# Altium project SBC_Project.PrjPcb (part 3 of 3)

## Sheet 05_SoC_Interfaces.SchDoc
size A3; SheetNumber: 16; SheetTotal: 21
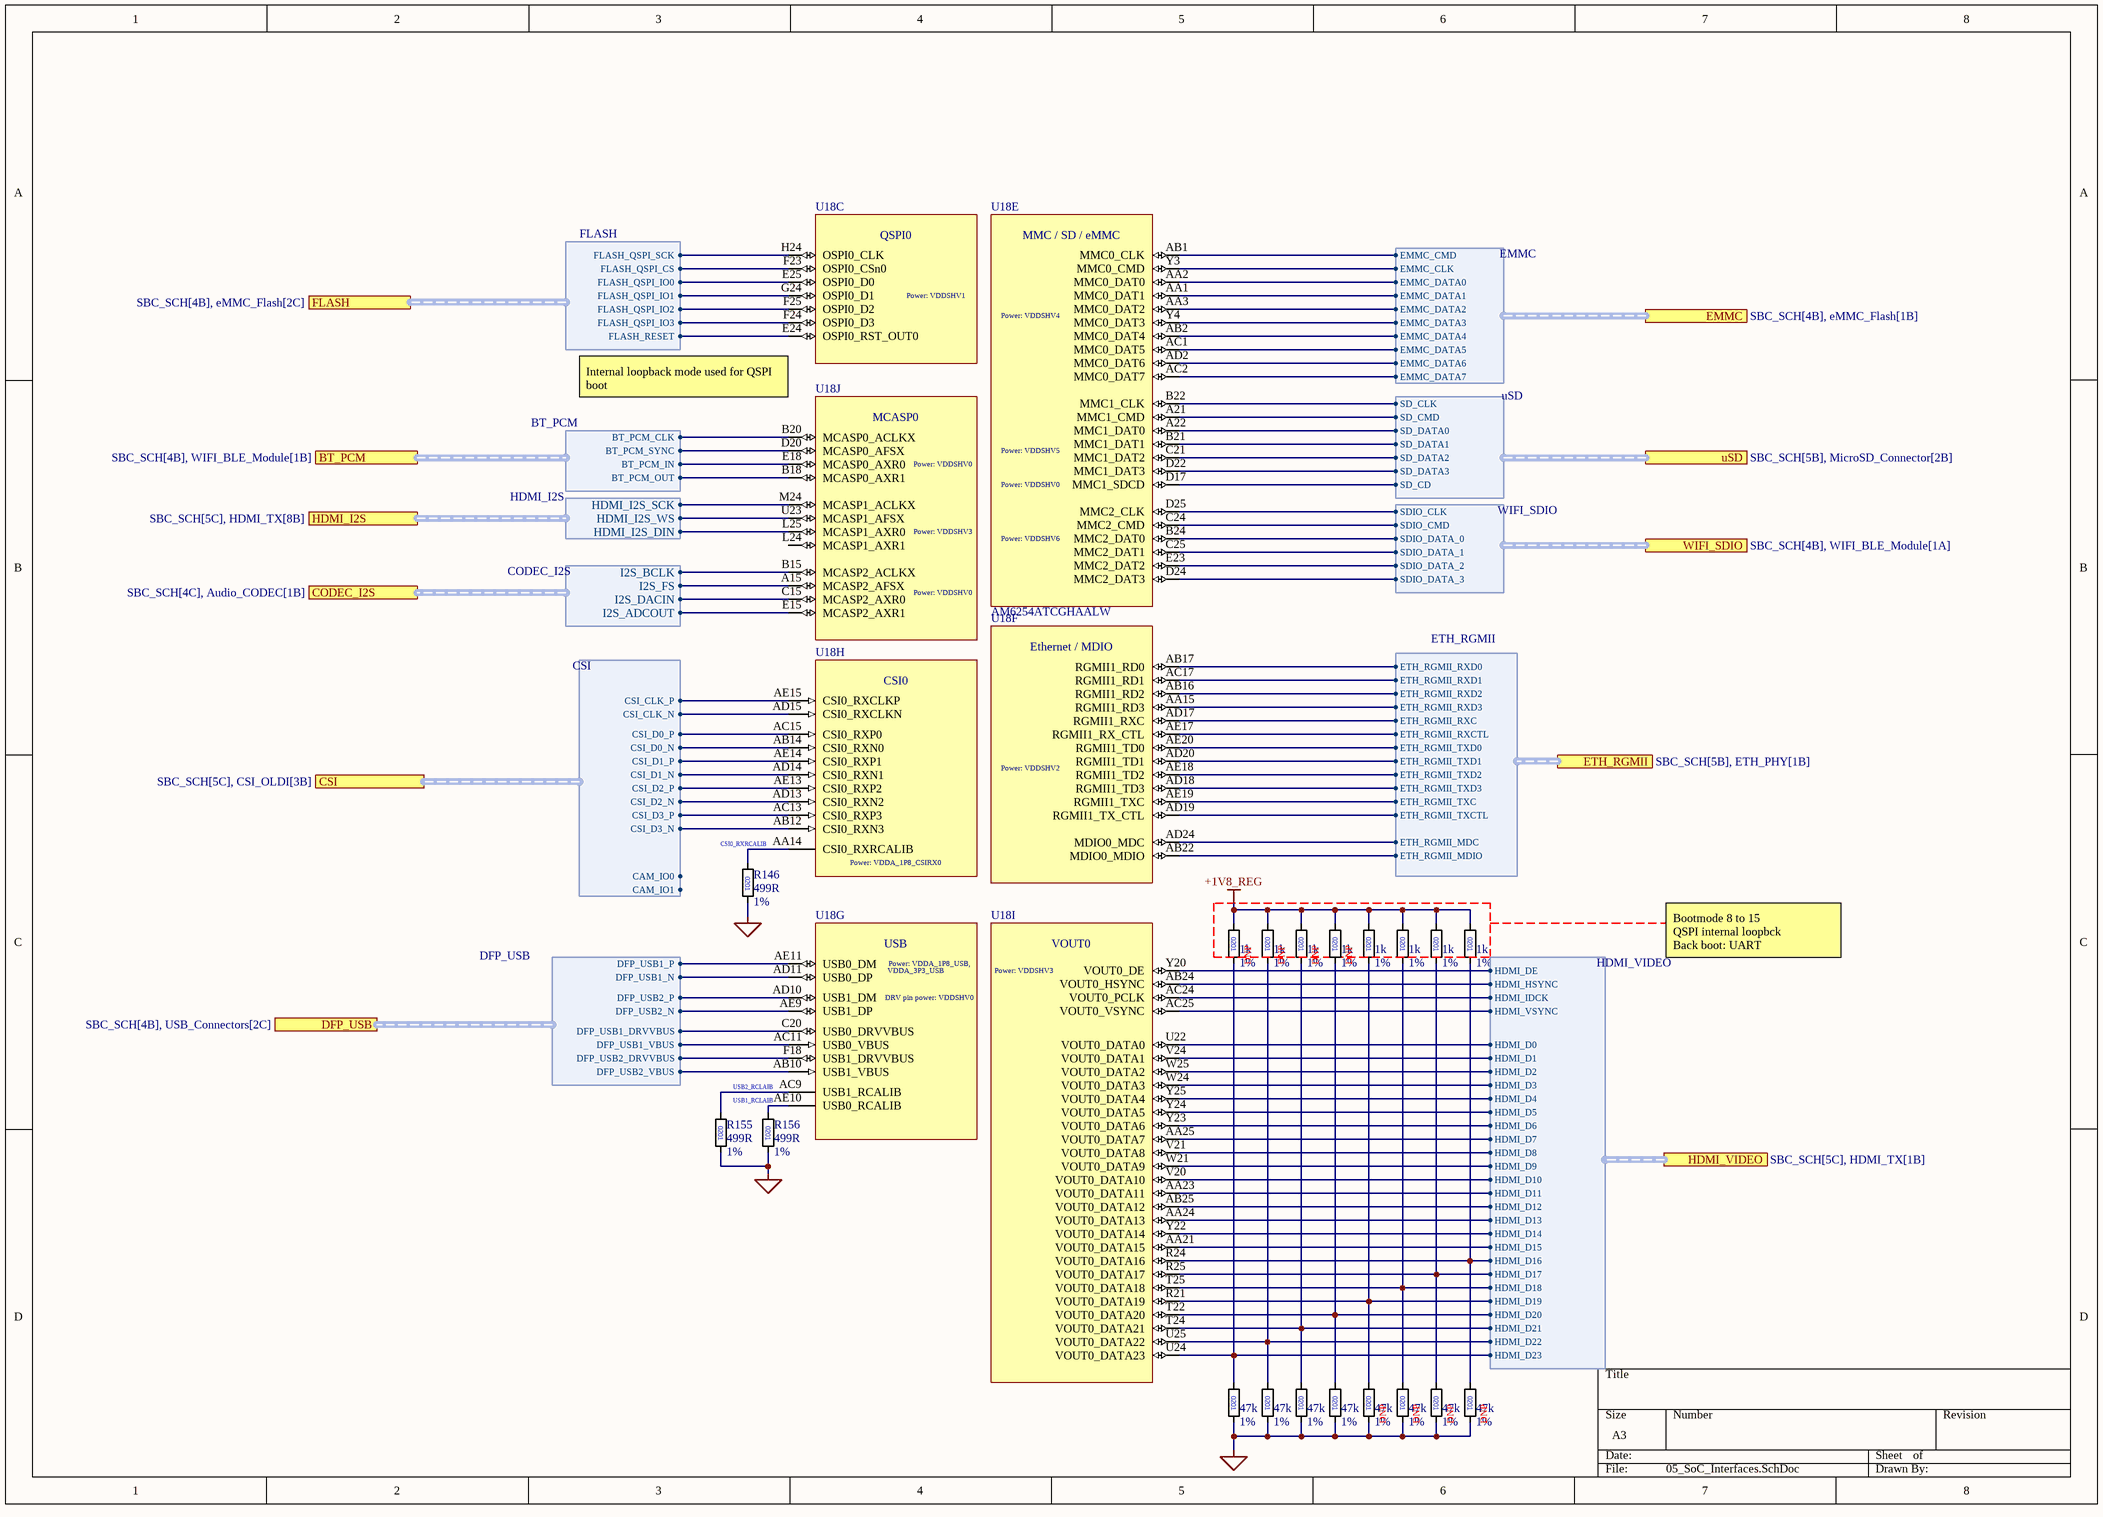
[diagram p15: 05_SoC_Interfaces.SchDoc]

### Parts
(Parts that share a designator on the sheet are numbered #1, #2 ... from top to bottom, then left to right.)
R146  value 499R  Tolerance: 1%  [R0201]  (hidden comment: 0201)
R147  value 1k  Tolerance: 1%  [R0201]  (hidden comment: 0201)
R148  value 1k  Tolerance: 1%  [R0201]  (hidden comment: 0201)
R149  value 1k  Tolerance: 1%  [R0201]  (hidden comment: 0201)
R150  value 1k  Tolerance: 1%  [R0201]  (hidden comment: 0201)
R151  value 1k  Tolerance: 1%  [R0201]  (hidden comment: 0201)
R152  value 1k  Tolerance: 1%  [R0201]  (hidden comment: 0201)
R153  value 1k  Tolerance: 1%  [R0201]  (hidden comment: 0201)
R154  value 1k  Tolerance: 1%  [R0201]  (hidden comment: 0201)
R155  value 499R  Tolerance: 1%  [R0201]  (hidden comment: 0201)
R156  value 499R  Tolerance: 1%  [R0201]  (hidden comment: 0201)
R157  value 47k  Tolerance: 1%  [R0201]  (hidden comment: 0201)
R158  value 47k  Tolerance: 1%  [R0201]  (hidden comment: 0201)
R159  value 47k  Tolerance: 1%  [R0201]  (hidden comment: 0201)
R160  value 47k  Tolerance: 1%  [R0201]  (hidden comment: 0201)
R161  value 47k  Tolerance: 1%  [R0201]  (hidden comment: 0201)
R162  value 47k  Tolerance: 1%  [R0201]  (hidden comment: 0201)
R163  value 47k  Tolerance: 1%  [R0201]  (hidden comment: 0201)
R164  value 47k  Tolerance: 1%  [R0201]  (hidden comment: 0201)
U18#1  AM6254ATCGHAALW  [AM6254ATCGHAALW]  (value not drawn)  (parts C,F,G,H,I,J of 15)
U18#2  AM6254ATCGHAALW  [AM6254ATCGHAALW]  (part E of 14)

### Ports
BT_PCM (harness BT_PCM, see SBC_SCH[4B], WIFI_BLE_Module[1B]), CODEC_I2S (harness CODEC_I2S, see SBC_SCH[4C], Audio_CODEC[1B]), CSI (harness CSI, see SBC_SCH[5C], CSI_OLDI[3B]), DFP_USB (harness DFP_USB, see SBC_SCH[4B], USB_Connectors[2C]), EMMC (harness EMMC, see SBC_SCH[4B], eMMC_Flash[1B]), ETH_RGMII (harness ETH_RGMII, see SBC_SCH[5B], ETH_PHY[1B]), FLASH (harness FLASH, see SBC_SCH[4B], eMMC_Flash[2C]), HDMI_I2S (harness HDMI_I2S, see SBC_SCH[5C], HDMI_TX[8B]), HDMI_VIDEO (harness HDMI_VIDEO, see SBC_SCH[5C], HDMI_TX[1B]), uSD (harness uSD, see SBC_SCH[5B], MicroSD_Connector[2B]), WIFI_SDIO (harness WIFI_SDIO, see SBC_SCH[4B], WIFI_BLE_Module[1A])

### Harnesses
EMMC: EMMC_DATA0, EMMC_DATA1, EMMC_DATA2, EMMC_DATA3, EMMC_DATA4, EMMC_DATA5, EMMC_DATA6, EMMC_DATA7, EMMC_CMD, EMMC_CLK
WIFI_SDIO: SDIO_DATA_0, SDIO_DATA_1, SDIO_DATA_2, SDIO_DATA_3, SDIO_CLK, SDIO_CMD
uSD: SD_DATA0, SD_DATA1, SD_DATA2, SD_DATA3, SD_CMD, SD_CLK, SD_CD
FLASH: FLASH_QSPI_SCK, FLASH_QSPI_CS, FLASH_QSPI_IO0, FLASH_QSPI_IO1, FLASH_QSPI_IO2, FLASH_QSPI_IO3, FLASH_RESET
BT_PCM: BT_PCM_CLK, BT_PCM_SYNC, BT_PCM_IN, BT_PCM_OUT
CODEC_I2S: I2S_BCLK, I2S_FS, I2S_ADCOUT, I2S_DACIN
ETH_RGMII: ETH_RGMII_RXD0, ETH_RGMII_RXD1, ETH_RGMII_RXD2, ETH_RGMII_RXD3, ETH_RGMII_RXC, ETH_RGMII_RXCTL, ETH_RGMII_TXD0, ETH_RGMII_TXD1, ETH_RGMII_TXD2, ETH_RGMII_TXD3, ETH_RGMII_TXC, ETH_RGMII_TXCTL, ETH_RGMII_MDC, ETH_RGMII_MDIO
HDMI_I2S: HDMI_I2S_SCK, HDMI_I2S_WS, HDMI_I2S_DIN
HDMI_VIDEO: HDMI_IDCK, HDMI_D0, HDMI_D1, HDMI_D2, HDMI_D3, HDMI_D4, HDMI_D5, HDMI_D6, HDMI_D7, HDMI_D8, HDMI_D9, HDMI_D10, HDMI_D11, HDMI_D12, HDMI_D13, HDMI_D14, HDMI_D15, HDMI_D16, HDMI_D17, HDMI_D18, HDMI_D19, HDMI_D20, HDMI_D21, HDMI_D22, HDMI_D23, HDMI_HSYNC, HDMI_VSYNC, HDMI_DE
CSI: CSI_D0_N, CSI_D0_P, CSI_D1_N, CSI_D1_P, CSI_CLK_N, CSI_CLK_P, CSI_D2_P, CSI_D2_N, CSI_D3_N, CSI_D3_P, CAM_IO0, CAM_IO1
DFP_USB: DFP_USB1_P, DFP_USB1_N, DFP_USB2_P, DFP_USB2_N, DFP_USB1_DRVVBUS, DFP_USB1_VBUS, DFP_USB2_DRVVBUS, DFP_USB2_VBUS

### Nets
+1V8_REG: R147.1 R148.1 R149.1 R150.1 R151.1 R152.1 R153.1 R154.1
GND: R146.2 R155.2 R156.2 R157.2 R158.2 R159.2 R160.2 R161.2 R162.2 R163.2 R164.2
BT_PCM_CLK: U18#1.B20(MCASP0_ACLKX) ; port BT_PCM.BT_PCM_CLK
BT_PCM_IN: U18#1.E18(MCASP0_AXR0) ; port BT_PCM.BT_PCM_IN
BT_PCM_OUT: U18#1.B18(MCASP0_AXR1) ; port BT_PCM.BT_PCM_OUT
BT_PCM_SYNC: U18#1.D20(MCASP0_AFSX) ; port BT_PCM.BT_PCM_SYNC
CSI0_RXRCALIB: R146.1 U18#1.AA14(CSI0_RXRCALIB)
CSI_CLK_N: U18#1.AD15(CSI0_RXCLKN) ; port CSI.CSI_CLK_N
CSI_CLK_P: U18#1.AE15(CSI0_RXCLKP) ; port CSI.CSI_CLK_P
CSI_D0_N: U18#1.AB14(CSI0_RXN0) ; port CSI.CSI_D0_N
CSI_D0_P: U18#1.AC15(CSI0_RXP0) ; port CSI.CSI_D0_P
CSI_D1_N: U18#1.AD14(CSI0_RXN1) ; port CSI.CSI_D1_N
CSI_D1_P: U18#1.AE14(CSI0_RXP1) ; port CSI.CSI_D1_P
CSI_D2_N: U18#1.AD13(CSI0_RXN2) ; port CSI.CSI_D2_N
CSI_D2_P: U18#1.AE13(CSI0_RXP2) ; port CSI.CSI_D2_P
CSI_D3_N: U18#1.AB12(CSI0_RXN3) ; port CSI.CSI_D3_N
CSI_D3_P: U18#1.AC13(CSI0_RXP3) ; port CSI.CSI_D3_P
DFP_USB1_EN: U18#1.C20(USB0_DRVVBUS) ; port DFP_USB.DFP_USB1_DRVVBUS
DFP_USB1_N: U18#1.AD11(USB0_DP) ; port DFP_USB.DFP_USB1_N
DFP_USB1_P: U18#1.AE11(USB0_DM) ; port DFP_USB.DFP_USB1_P
DFP_USB1_VBUS_SENSE: U18#1.AC11(USB0_VBUS) ; port DFP_USB.DFP_USB1_VBUS
DFP_USB2_EN: U18#1.F18(USB1_DRVVBUS) ; port DFP_USB.DFP_USB2_DRVVBUS
DFP_USB2_N: U18#1.AE9(USB1_DP) ; port DFP_USB.DFP_USB2_N
DFP_USB2_P: U18#1.AD10(USB1_DM) ; port DFP_USB.DFP_USB2_P
DFP_USB2_VBUS_SENSE: U18#1.AB10(USB1_VBUS) ; port DFP_USB.DFP_USB2_VBUS
EMMC_CLK: U18#2.Y3(MMC0_CMD) ; port EMMC.EMMC_CLK
EMMC_CMD: U18#2.AB1(MMC0_CLK) ; port EMMC.EMMC_CMD
EMMC_DATA0: U18#2.AA2(MMC0_DAT0) ; port EMMC.EMMC_DATA0
EMMC_DATA1: U18#2.AA1(MMC0_DAT1) ; port EMMC.EMMC_DATA1
EMMC_DATA2: U18#2.AA3(MMC0_DAT2) ; port EMMC.EMMC_DATA2
EMMC_DATA3: U18#2.Y4(MMC0_DAT3) ; port EMMC.EMMC_DATA3
EMMC_DATA4: U18#2.AB2(MMC0_DAT4) ; port EMMC.EMMC_DATA4
EMMC_DATA5: U18#2.AC1(MMC0_DAT5) ; port EMMC.EMMC_DATA5
EMMC_DATA6: U18#2.AD2(MMC0_DAT6) ; port EMMC.EMMC_DATA6
EMMC_DATA7: U18#2.AC2(MMC0_DAT7) ; port EMMC.EMMC_DATA7
FLASH_QSPI_CS: U18#1.F23(OSPI0_CSn0) ; port FLASH.FLASH_QSPI_CS
FLASH_QSPI_IO0: U18#1.E25(OSPI0_D0) ; port FLASH.FLASH_QSPI_IO0
FLASH_QSPI_IO1: U18#1.G24(OSPI0_D1) ; port FLASH.FLASH_QSPI_IO1
FLASH_QSPI_IO2: U18#1.F25(OSPI0_D2) ; port FLASH.FLASH_QSPI_IO2
FLASH_QSPI_IO3: U18#1.F24(OSPI0_D3) ; port FLASH.FLASH_QSPI_IO3
FLASH_QSPI_SCK: U18#1.H24(OSPI0_CLK) ; port FLASH.FLASH_QSPI_SCK
FLASH_RESET: U18#1.E24(OSPI0_RST_OUT0) ; port FLASH.FLASH_RESET
HDMI_D0: U18#1.U22(VOUT0_DATA0) ; port HDMI_VIDEO.HDMI_D0
HDMI_D1: U18#1.V24(VOUT0_DATA1) ; port HDMI_VIDEO.HDMI_D1
HDMI_D2: U18#1.W25(VOUT0_DATA2) ; port HDMI_VIDEO.HDMI_D2
HDMI_D3: U18#1.W24(VOUT0_DATA3) ; port HDMI_VIDEO.HDMI_D3
HDMI_D4: U18#1.Y25(VOUT0_DATA4) ; port HDMI_VIDEO.HDMI_D4
HDMI_D5: U18#1.Y24(VOUT0_DATA5) ; port HDMI_VIDEO.HDMI_D5
HDMI_D6: U18#1.Y23(VOUT0_DATA6) ; port HDMI_VIDEO.HDMI_D6
HDMI_D7: U18#1.AA25(VOUT0_DATA7) ; port HDMI_VIDEO.HDMI_D7
HDMI_D8: U18#1.V21(VOUT0_DATA8) ; port HDMI_VIDEO.HDMI_D8
HDMI_D9: U18#1.W21(VOUT0_DATA9) ; port HDMI_VIDEO.HDMI_D9
HDMI_D10: U18#1.V20(VOUT0_DATA10) ; port HDMI_VIDEO.HDMI_D10
HDMI_D11: U18#1.AA23(VOUT0_DATA11) ; port HDMI_VIDEO.HDMI_D11
HDMI_D12: U18#1.AB25(VOUT0_DATA12) ; port HDMI_VIDEO.HDMI_D12
HDMI_D13: U18#1.AA24(VOUT0_DATA13) ; port HDMI_VIDEO.HDMI_D13
HDMI_D14: U18#1.Y22(VOUT0_DATA14) ; port HDMI_VIDEO.HDMI_D14
HDMI_D15: U18#1.AA21(VOUT0_DATA15) ; port HDMI_VIDEO.HDMI_D15
HDMI_D16: R154.2 R164.1 U18#1.R24(VOUT0_DATA16) ; port HDMI_VIDEO.HDMI_D16
HDMI_D17: R153.2 R163.1 U18#1.R25(VOUT0_DATA17) ; port HDMI_VIDEO.HDMI_D17
HDMI_D18: R152.2 R162.1 U18#1.T25(VOUT0_DATA18) ; port HDMI_VIDEO.HDMI_D18
HDMI_D19: R151.2 R161.1 U18#1.R21(VOUT0_DATA19) ; port HDMI_VIDEO.HDMI_D19
HDMI_D20: R150.2 R160.1 U18#1.T22(VOUT0_DATA20) ; port HDMI_VIDEO.HDMI_D20
HDMI_D21: R149.2 R159.1 U18#1.T24(VOUT0_DATA21) ; port HDMI_VIDEO.HDMI_D21
HDMI_D22: R148.2 R158.1 U18#1.U25(VOUT0_DATA22) ; port HDMI_VIDEO.HDMI_D22
HDMI_D23: R147.2 R157.1 U18#1.U24(VOUT0_DATA23) ; port HDMI_VIDEO.HDMI_D23
HDMI_DE: U18#1.Y20(VOUT0_DE) ; port HDMI_VIDEO.HDMI_DE
HDMI_HSYNC: U18#1.AB24(VOUT0_HSYNC) ; port HDMI_VIDEO.HDMI_HSYNC
HDMI_I2S_DIN: U18#1.L25(MCASP1_AXR0) ; port HDMI_I2S.HDMI_I2S_DIN
HDMI_I2S_SCK: U18#1.M24(MCASP1_ACLKX) ; port HDMI_I2S.HDMI_I2S_SCK
HDMI_I2S_WS: U18#1.U23(MCASP1_AFSX) ; port HDMI_I2S.HDMI_I2S_WS
HDMI_IDCK: U18#1.AC24(VOUT0_PCLK) ; port HDMI_VIDEO.HDMI_IDCK
HDMI_VSYNC: U18#1.AC25(VOUT0_VSYNC) ; port HDMI_VIDEO.HDMI_VSYNC
I2S_ADCOUT: U18#1.E15(MCASP2_AXR1) ; port CODEC_I2S.I2S_ADCOUT
I2S_BCLK: U18#1.B15(MCASP2_ACLKX) ; port CODEC_I2S.I2S_BCLK
I2S_DACIN: U18#1.C15(MCASP2_AXR0) ; port CODEC_I2S.I2S_DACIN
I2S_FS: U18#1.A15(MCASP2_AFSX) ; port CODEC_I2S.I2S_FS
SD_CD: U18#2.D17(MMC1_SDCD) ; port uSD.SD_CD
SD_CLK: U18#2.B22(MMC1_CLK) ; port uSD.SD_CLK
SD_CMD: U18#2.A21(MMC1_CMD) ; port uSD.SD_CMD
SD_DATA0: U18#2.A22(MMC1_DAT0) ; port uSD.SD_DATA0
SD_DATA1: U18#2.B21(MMC1_DAT1) ; port uSD.SD_DATA1
SD_DATA2: U18#2.C21(MMC1_DAT2) ; port uSD.SD_DATA2
SD_DATA3: U18#2.D22(MMC1_DAT3) ; port uSD.SD_DATA3
USB1_RCLAIB: R156.1 U18#1.AE10(USB0_RCALIB)
USB2_RCLAIB: R155.1 U18#1.AC9(USB1_RCALIB)
WIFI_SDIO_CLK: U18#2.D25(MMC2_CLK) ; port WIFI_SDIO.SDIO_CLK
WIFI_SDIO_CMD: U18#2.C24(MMC2_CMD) ; port WIFI_SDIO.SDIO_CMD
WIFI_SDIO_DATA_0: U18#2.B24(MMC2_DAT0) ; port WIFI_SDIO.SDIO_DATA_0
WIFI_SDIO_DATA_1: U18#2.C25(MMC2_DAT1) ; port WIFI_SDIO.SDIO_DATA_1
WIFI_SDIO_DATA_2: U18#2.E23(MMC2_DAT2) ; port WIFI_SDIO.SDIO_DATA_2
WIFI_SDIO_DATA_3: U18#2.D24(MMC2_DAT3) ; port WIFI_SDIO.SDIO_DATA_3
NetU18#1_AA15: U18#1.AA15(RGMII1_RD3) ; port ETH_RGMII.ETH_RGMII_RXD3
NetU18#1_AB16: U18#1.AB16(RGMII1_RD2) ; port ETH_RGMII.ETH_RGMII_RXD2
NetU18#1_AB17: U18#1.AB17(RGMII1_RD0) ; port ETH_RGMII.ETH_RGMII_RXD0
NetU18#1_AB22: U18#1.AB22(MDIO0_MDIO) ; port ETH_RGMII.ETH_RGMII_MDIO
NetU18#1_AC17: U18#1.AC17(RGMII1_RD1) ; port ETH_RGMII.ETH_RGMII_RXD1
NetU18#1_AD17: U18#1.AD17(RGMII1_RXC) ; port ETH_RGMII.ETH_RGMII_RXC
NetU18#1_AD18: U18#1.AD18(RGMII1_TD3) ; port ETH_RGMII.ETH_RGMII_TXD3
NetU18#1_AD19: U18#1.AD19(RGMII1_TX_CTL) ; port ETH_RGMII.ETH_RGMII_TXCTL
NetU18#1_AD20: U18#1.AD20(RGMII1_TD1) ; port ETH_RGMII.ETH_RGMII_TXD1
NetU18#1_AD24: U18#1.AD24(MDIO0_MDC) ; port ETH_RGMII.ETH_RGMII_MDC
NetU18#1_AE17: U18#1.AE17(RGMII1_RX_CTL) ; port ETH_RGMII.ETH_RGMII_RXCTL
NetU18#1_AE18: U18#1.AE18(RGMII1_TD2) ; port ETH_RGMII.ETH_RGMII_TXD2
NetU18#1_AE19: U18#1.AE19(RGMII1_TXC) ; port ETH_RGMII.ETH_RGMII_TXC
NetU18#1_AE20: U18#1.AE20(RGMII1_TD0) ; port ETH_RGMII.ETH_RGMII_TXD0

Not connected (* = marked no-connect by the designer): U18#1 L24(MCASP1_AXR1)

### Notes on the sheet
- (near U18#1) Internal loopback mode used for QSPI boot
- (near R147) DNP
- (near R148) DNP
- (near R149) DNP
- (near R150) DNP
- Bootmode 8 to 15
  QSPI internal loopbck
  Back boot: UART
- (near R161) DNP
- (near R162) DNP
- (near R163) DNP
- (near R164) DNP
- (in symbol AM6254ATCGHAALW, part C) QSPI0; Power: VDDSHV1
- (in symbol AM6254ATCGHAALW, part E) MMC / SD / eMMC; Power: VDDSHV4; Power: VDDSHV5; Power: VDDSHV0; Power: VDDSHV6
- (in symbol AM6254ATCGHAALW, part F) Ethernet / MDIO; Power: VDDSHV2
- (in symbol AM6254ATCGHAALW, part G) USB; Power: VDDA_1P8_USB,; DRV pin power: VDDSHV0
- (in symbol AM6254ATCGHAALW, part H) CSI0; Power: VDDA_1P8_CSIRX0
- (in symbol AM6254ATCGHAALW, part I) VOUT0; Power: VDDSHV3
- (in symbol AM6254ATCGHAALW, part J) MCASP0; Power: VDDSHV0; Power: VDDSHV3

### Library data of the parts
R146-R164 = R_0201: Manufacturer_Name: *; Manufacturer_Part_Number: *
U18#1 U18#2 = AM6254ATCGHAALW: as U18#1 on sheet 03_SoC_Power; MPN: AM6254ATCGHAALW; Footprint_Note: Unassigned: requires verified ALW0425 425-ball FCCSP, 13x13mm, 0.5mm pitch; do not substitute a fully populated BGA.; Datasheet: https://www.ti.com/lit/ds/symlink/am625.pdf; ComponentLink1Description: Datasheet; ComponentLink1URL: https://www.ti.com/lit/ds/symlink/am625.pdf

## Sheet 17_HDMI_TX.SchDoc
size A3; SheetNumber: 17; SheetTotal: 21
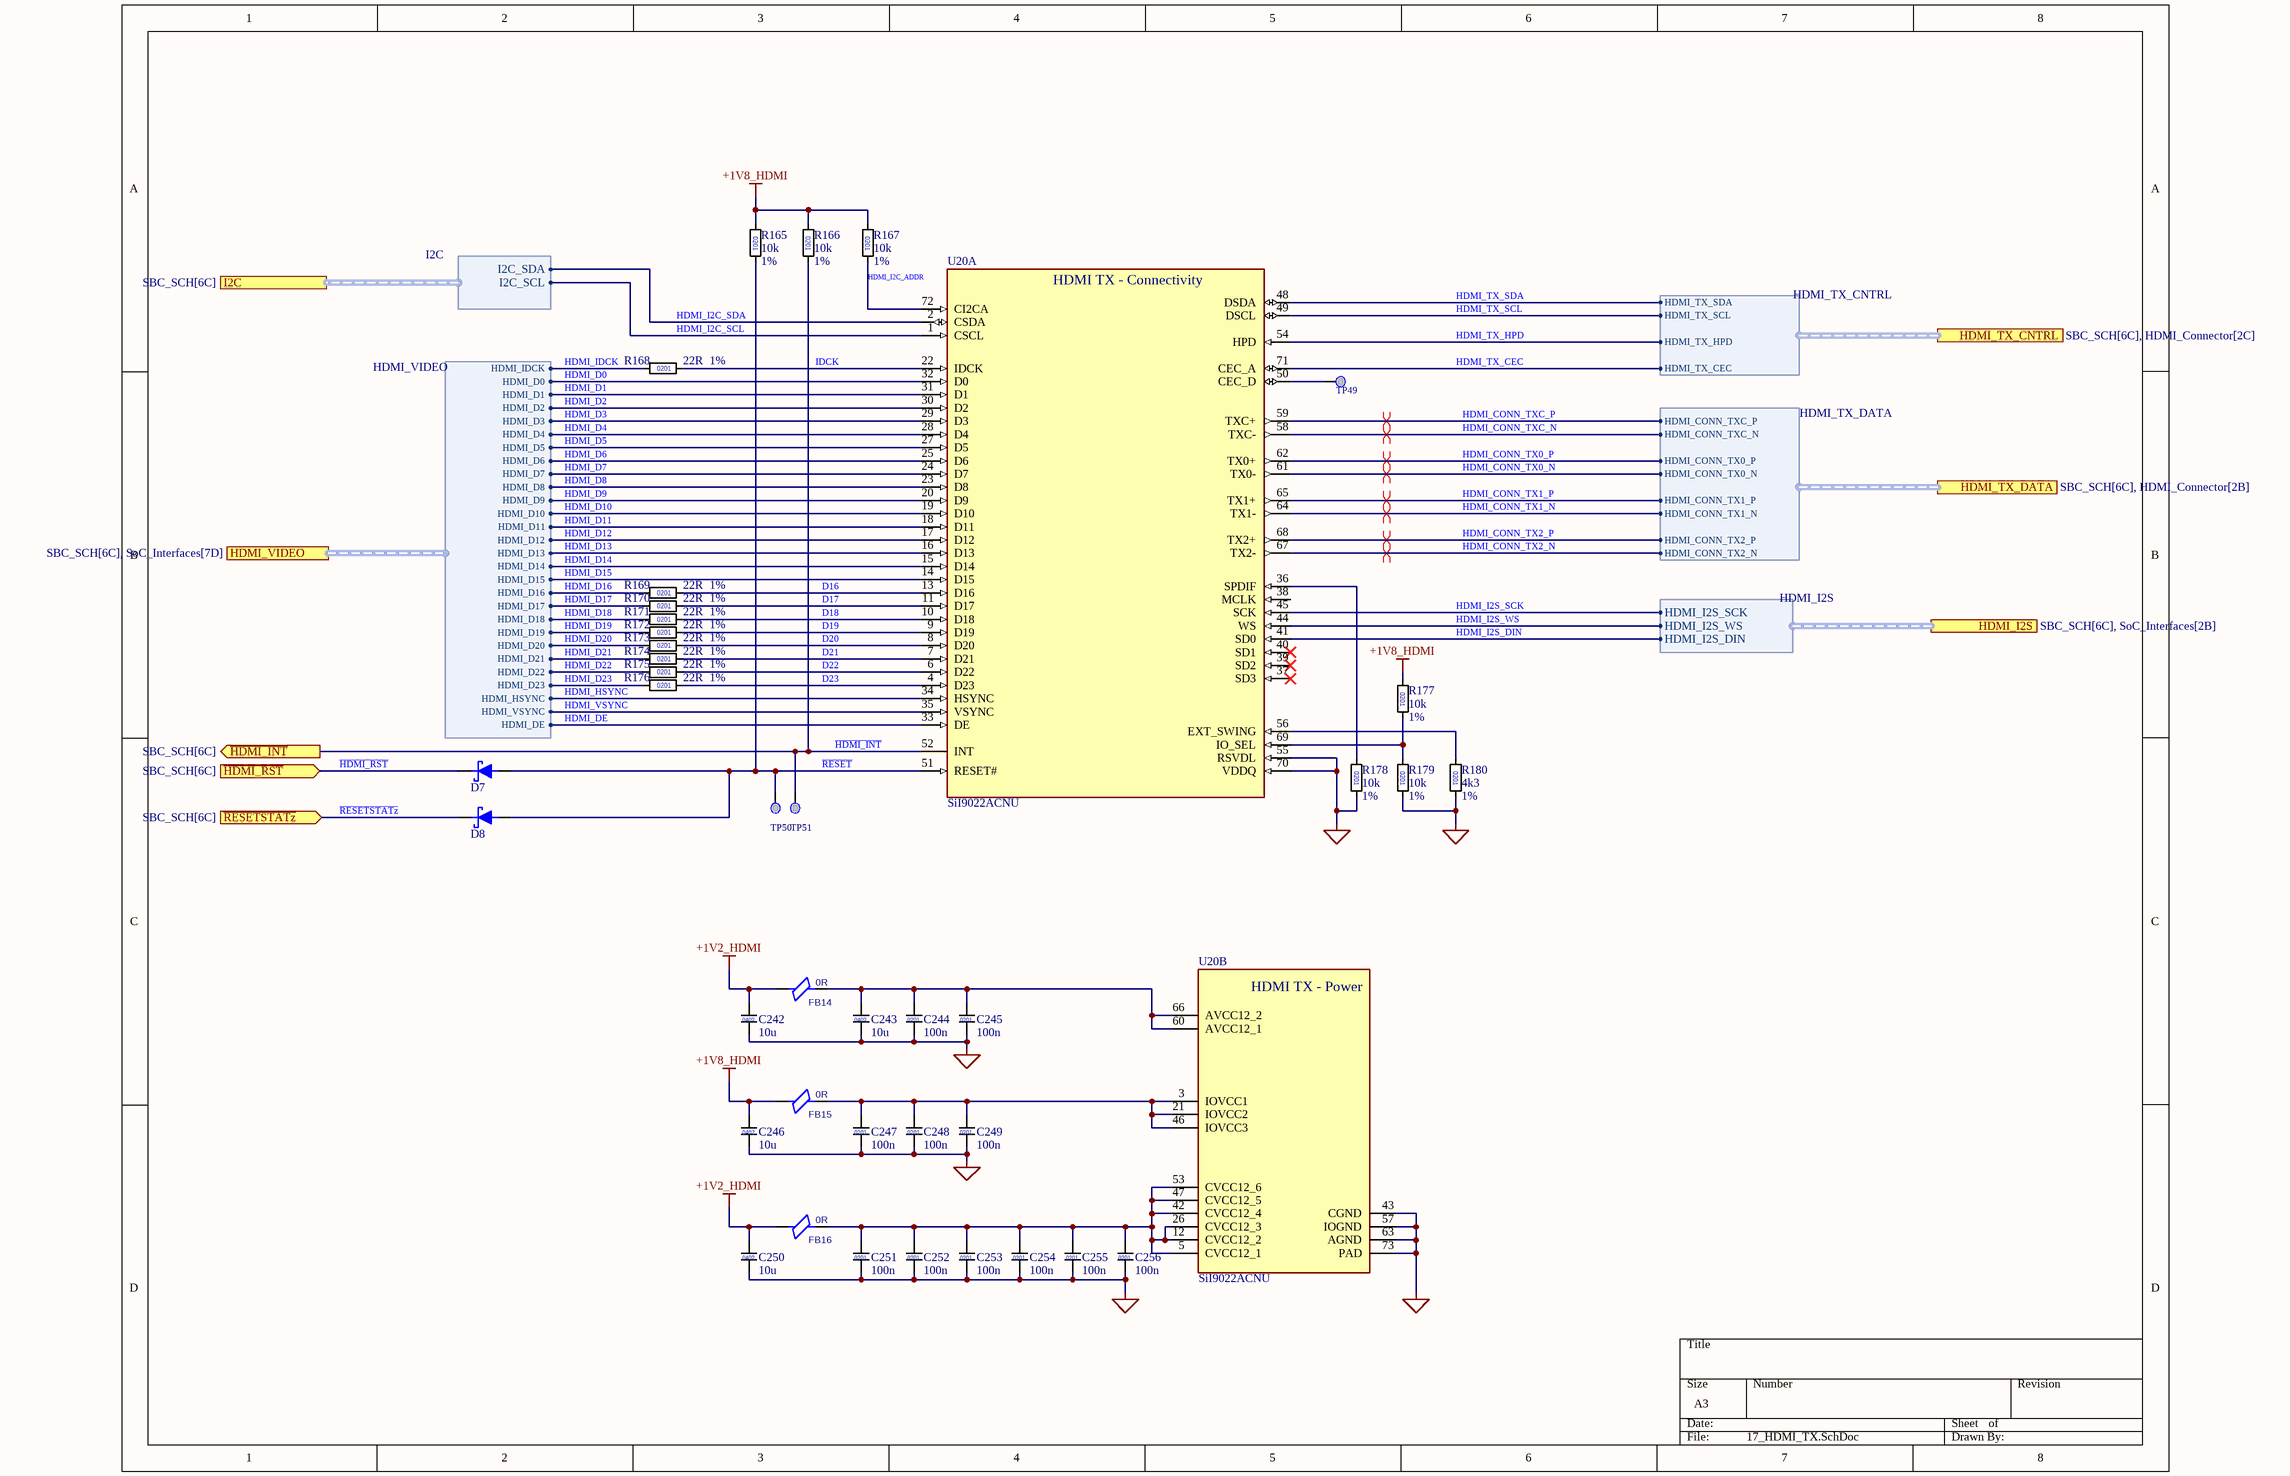
[diagram p16: 17_HDMI_TX.SchDoc]

### Parts
C242  value 10u  [C0402]  (hidden comment: 4u7)
C243  value 10u  [C0402]  (hidden comment: 4u7)
C244  value 100n  [C0201]  (hidden comment: C_0201)
C245  value 100n  [C0201]  (hidden comment: C_0201)
C246  value 10u  [C0402]  (hidden comment: 4u7)
C247  value 100n  [C0201]  (hidden comment: C_0201)
C248  value 100n  [C0201]  (hidden comment: C_0201)
C249  value 100n  [C0201]  (hidden comment: C_0201)
C250  value 10u  [C0402]  (hidden comment: 4u7)
C251  value 100n  [C0201]  (hidden comment: C_0201)
C252  value 100n  [C0201]  (hidden comment: C_0201)
C253  value 100n  [C0201]  (hidden comment: C_0201)
C254  value 100n  [C0201]  (hidden comment: C_0201)
C255  value 100n  [C0201]  (hidden comment: C_0201)
C256  value 100n  [C0201]  (hidden comment: C_0201)
D7  D_Filled  [D_SOD-523]  (value not drawn)
D8  D_Filled  [D_SOD-523]  (value not drawn)
FB14  value 0R  [FB0201]  (hidden comment: FB_0201)
FB15  value 0R  [FB0201]  (hidden comment: FB_0201)
FB16  value 0R  [FB0201]  (hidden comment: FB_0201)
R165  value 10k  Tolerance: 1%  [R0201]  (hidden comment: 0201)
R166  value 10k  Tolerance: 1%  [R0201]  (hidden comment: 0201)
R167  value 10k  Tolerance: 1%  [R0201]  (hidden comment: 0201)
R168  value 22R  Tolerance: 1%  [R0201]  (hidden comment: 0201)
R169  value 22R  Tolerance: 1%  [R0201]  (hidden comment: 0201)
R170  value 22R  Tolerance: 1%  [R0201]  (hidden comment: 0201)
R171  value 22R  Tolerance: 1%  [R0201]  (hidden comment: 0201)
R172  value 22R  Tolerance: 1%  [R0201]  (hidden comment: 0201)
R173  value 22R  Tolerance: 1%  [R0201]  (hidden comment: 0201)
R174  value 22R  Tolerance: 1%  [R0201]  (hidden comment: 0201)
R175  value 22R  Tolerance: 1%  [R0201]  (hidden comment: 0201)
R176  value 22R  Tolerance: 1%  [R0201]  (hidden comment: 0201)
R177  value 10k  Tolerance: 1%  [R0201]  (hidden comment: 0201)
R178  value 10k  Tolerance: 1%  [R0201]  (hidden comment: 0201)
R179  value 10k  Tolerance: 1%  [R0201]  (hidden comment: 0201)
R180  value 4k3  Tolerance: 1%  [R0201]  (hidden comment: 0201)
TP49  Testpoint 0.5mm  [TP_0.50mm]  (value not drawn)  (no BOM)
TP50  Testpoint 0.5mm  [TP_0.50mm]  (value not drawn)  (no BOM)
TP51  Testpoint 0.5mm  [TP_0.50mm]  (value not drawn)  (no BOM)
U20  SiI9022ACNU  [QFN-72-1EP_10x10mm_P0.5mm_EP4.7x4.7mm]  (parts A,B of 2)

### Ports
HDMI_I2S (harness HDMI_I2S, see SBC_SCH[6C], SoC_Interfaces[2B]), HDMI_TX_CNTRL (harness HDMI_TX_CNTRL, see SBC_SCH[6C], HDMI_Connector[2C]), HDMI_TX_DATA (harness HDMI_TX_DATA, see SBC_SCH[6C], HDMI_Connector[2B]), HDMI_VIDEO (harness HDMI_VIDEO, see SBC_SCH[6C], SoC_Interfaces[7D]), I2C (harness I2C, see SBC_SCH[6C]), ~{HDMI_INT} (out, see SBC_SCH[6C]), ~{HDMI_RST} (in, see SBC_SCH[6C]), ~{RESETSTATz} (in, see SBC_SCH[6C])

### Harnesses
HDMI_VIDEO: HDMI_IDCK, HDMI_D0, HDMI_D1, HDMI_D2, HDMI_D3, HDMI_D4, HDMI_D5, HDMI_D6, HDMI_D7, HDMI_D8, HDMI_D9, HDMI_D10, HDMI_D11, HDMI_D12, HDMI_D13, HDMI_D14, HDMI_D15, HDMI_D16, HDMI_D17, HDMI_D18, HDMI_D19, HDMI_D20, HDMI_D21, HDMI_D22, HDMI_D23, HDMI_HSYNC, HDMI_VSYNC, HDMI_DE
HDMI_I2S: HDMI_I2S_SCK, HDMI_I2S_WS, HDMI_I2S_DIN
I2C: I2C_SDA, I2C_SCL
HDMI_TX_DATA: HDMI_CONN_TXC_P, HDMI_CONN_TXC_N, HDMI_CONN_TX0_P, HDMI_CONN_TX0_N, HDMI_CONN_TX1_P, HDMI_CONN_TX1_N, HDMI_CONN_TX2_P, HDMI_CONN_TX2_N
HDMI_TX_CNTRL: HDMI_TX_SDA, HDMI_TX_SCL, HDMI_TX_HPD, HDMI_TX_CEC

### Nets
+1V2_HDMI: C242.1 C250.1 FB14.1 FB16.1
+1V8_HDMI: C246.1 FB15.1 R165.1 R166.1 R167.1 R177.1
GND: C242.2 C243.2 C244.2 C245.2 C246.2 C247.2 C248.2 C249.2 C250.2 C251.2 C252.2 C253.2 C254.2 C255.2 C256.2 R178.2 R179.2 R180.2 U20.43(CGND) U20.55(RSVDL) U20.57(IOGND) U20.63(AGND) U20.70(VDDQ) U20.73(PAD)
~{HDMI_INT}: R166.2 TP51.TP U20.52(INT) ; port ~{HDMI_INT}
~{HDMI_RST}: D7.1(K) ; port ~{HDMI_RST}
~{RESET}: D7.2(A) D8.2(A) R165.2 TP50.TP U20.51(RESET#)
~{RESETSTATz}: D8.1(K) ; port ~{RESETSTATz}
D16: R169.2 U20.13(D16)
D17: R170.2 U20.11(D17)
D18: R171.2 U20.10(D18)
D19: R172.2 U20.9(D19)
D20: R173.2 U20.8(D20)
D21: R174.2 U20.7(D21)
D22: R175.2 U20.6(D22)
D23: R176.2 U20.4(D23)
HDMI_CONN_TX0_N: U20.61(TX0-) ; port HDMI_TX_DATA.HDMI_CONN_TX0_N
HDMI_CONN_TX0_P: U20.62(TX0+) ; port HDMI_TX_DATA.HDMI_CONN_TX0_P
HDMI_CONN_TX1_N: U20.64(TX1-) ; port HDMI_TX_DATA.HDMI_CONN_TX1_N
HDMI_CONN_TX1_P: U20.65(TX1+) ; port HDMI_TX_DATA.HDMI_CONN_TX1_P
HDMI_CONN_TX2_N: U20.67(TX2-) ; port HDMI_TX_DATA.HDMI_CONN_TX2_N
HDMI_CONN_TX2_P: U20.68(TX2+) ; port HDMI_TX_DATA.HDMI_CONN_TX2_P
HDMI_CONN_TXC_N: U20.58(TXC-) ; port HDMI_TX_DATA.HDMI_CONN_TXC_N
HDMI_CONN_TXC_P: U20.59(TXC+) ; port HDMI_TX_DATA.HDMI_CONN_TXC_P
HDMI_D0: U20.32(D0) ; port HDMI_VIDEO.HDMI_D0
HDMI_D1: U20.31(D1) ; port HDMI_VIDEO.HDMI_D1
HDMI_D2: U20.30(D2) ; port HDMI_VIDEO.HDMI_D2
HDMI_D3: U20.29(D3) ; port HDMI_VIDEO.HDMI_D3
HDMI_D4: U20.28(D4) ; port HDMI_VIDEO.HDMI_D4
HDMI_D5: U20.27(D5) ; port HDMI_VIDEO.HDMI_D5
HDMI_D6: U20.25(D6) ; port HDMI_VIDEO.HDMI_D6
HDMI_D7: U20.24(D7) ; port HDMI_VIDEO.HDMI_D7
HDMI_D8: U20.23(D8) ; port HDMI_VIDEO.HDMI_D8
HDMI_D9: U20.20(D9) ; port HDMI_VIDEO.HDMI_D9
HDMI_D10: U20.19(D10) ; port HDMI_VIDEO.HDMI_D10
HDMI_D11: U20.18(D11) ; port HDMI_VIDEO.HDMI_D11
HDMI_D12: U20.17(D12) ; port HDMI_VIDEO.HDMI_D12
HDMI_D13: U20.16(D13) ; port HDMI_VIDEO.HDMI_D13
HDMI_D14: U20.15(D14) ; port HDMI_VIDEO.HDMI_D14
HDMI_D15: U20.14(D15) ; port HDMI_VIDEO.HDMI_D15
HDMI_D16: R169.1 ; port HDMI_VIDEO.HDMI_D16
HDMI_D17: R170.1 ; port HDMI_VIDEO.HDMI_D17
HDMI_D18: R171.1 ; port HDMI_VIDEO.HDMI_D18
HDMI_D19: R172.1 ; port HDMI_VIDEO.HDMI_D19
HDMI_D20: R173.1 ; port HDMI_VIDEO.HDMI_D20
HDMI_D21: R174.1 ; port HDMI_VIDEO.HDMI_D21
HDMI_D22: R175.1 ; port HDMI_VIDEO.HDMI_D22
HDMI_D23: R176.1 ; port HDMI_VIDEO.HDMI_D23
HDMI_DE: U20.33(DE) ; port HDMI_VIDEO.HDMI_DE
HDMI_HSYNC: U20.34(HSYNC) ; port HDMI_VIDEO.HDMI_HSYNC
HDMI_I2C_ADDR: R167.2 U20.72(CI2CA)
HDMI_I2C_SCL: U20.1(CSCL) ; port I2C.I2C_SCL
HDMI_I2C_SDA: U20.2(CSDA) ; port I2C.I2C_SDA
HDMI_I2S_DIN: U20.41(SD0) ; port HDMI_I2S.HDMI_I2S_DIN
HDMI_I2S_SCK: U20.45(SCK) ; port HDMI_I2S.HDMI_I2S_SCK
HDMI_I2S_WS: U20.44(WS) ; port HDMI_I2S.HDMI_I2S_WS
HDMI_IDCK: R168.1 ; port HDMI_VIDEO.HDMI_IDCK
HDMI_TX_CEC: U20.71(CEC_A) ; port HDMI_TX_CNTRL.HDMI_TX_CEC
HDMI_TX_HPD: U20.54(HPD) ; port HDMI_TX_CNTRL.HDMI_TX_HPD
HDMI_TX_SCL: U20.49(DSCL) ; port HDMI_TX_CNTRL.HDMI_TX_SCL
HDMI_TX_SDA: U20.48(DSDA) ; port HDMI_TX_CNTRL.HDMI_TX_SDA
HDMI_VSYNC: U20.35(VSYNC) ; port HDMI_VIDEO.HDMI_VSYNC
IDCK: R168.2 U20.22(IDCK)
NetC243_1: C243.1 C244.1 C245.1 FB14.2 U20.60(AVCC12_1) U20.66(AVCC12_2)
NetC247_1: C247.1 C248.1 C249.1 FB15.2 U20.3(IOVCC1) U20.21(IOVCC2) U20.46(IOVCC3)
NetC251_1: C251.1 C252.1 C253.1 C254.1 C255.1 C256.1 FB16.2 U20.5(CVCC12_1) U20.12(CVCC12_2) U20.26(CVCC12_3) U20.42(CVCC12_4) U20.47(CVCC12_5) U20.53(CVCC12_6)
NetR177_2: R177.2 R179.1 U20.69(IO_SEL)
NetR178_1: R178.1 U20.36(SPDIF)
NetR180_1: R180.1 U20.56(EXT_SWING)
NetTP49_TP: TP49.TP U20.50(CEC_D)

Not connected (* = marked no-connect by the designer): U20 37(SD3)* 38(MCLK) 39(SD2)* 40(SD1)*

### Layout directives
differential pair: HDMI_CONN_TX0_N, HDMI_CONN_TX0_P, HDMI_CONN_TX1_N, HDMI_CONN_TX1_P, HDMI_CONN_TX2_N, HDMI_CONN_TX2_P, HDMI_CONN_TXC_N, HDMI_CONN_TXC_P

### Notes on the sheet
- (in symbol C_0201) 0201
- (in symbol C_0402) 0402
- (in symbol SiI9022ACNU, part A) HDMI TX - Connectivity
- (in symbol SiI9022ACNU, part B) HDMI TX - Power

### Library data of the parts
C242 C243 C246 C250 = C_0402: MLCC 0402; Manufacturer_Name: *; Manufacturer_Part_Number: *
C244 C245 C247-C249 C251-C256 = C_0201: MLCC 0201; Manufacturer_Name: *; Manufacturer_Part_Number: *
D7 D8 = D_Filled: Diode, filled shape; Manufacturer_Name: Panjit International Inc.; Value: BAT54TS_R1_00001; Manufacturer Part Number: BAT54TS_R1_00001
FB14-FB16 = FB_0201: Ferrite bead; Parameter 1: *
R165-R180 = R_0201: Manufacturer_Name: *; Manufacturer_Part_Number: *
U20 = SiI9022ACNU: HDMI 1.4 transmitter with 24-bit parallel video; Manufacturer_Name: Lattice; Manufacturer_Part_Number: SiI9022ACNU; Value: SiI9022ACNU

## Sheet 18_HDMI_Connector.SchDoc
size A3; SheetNumber: 18; SheetTotal: 21
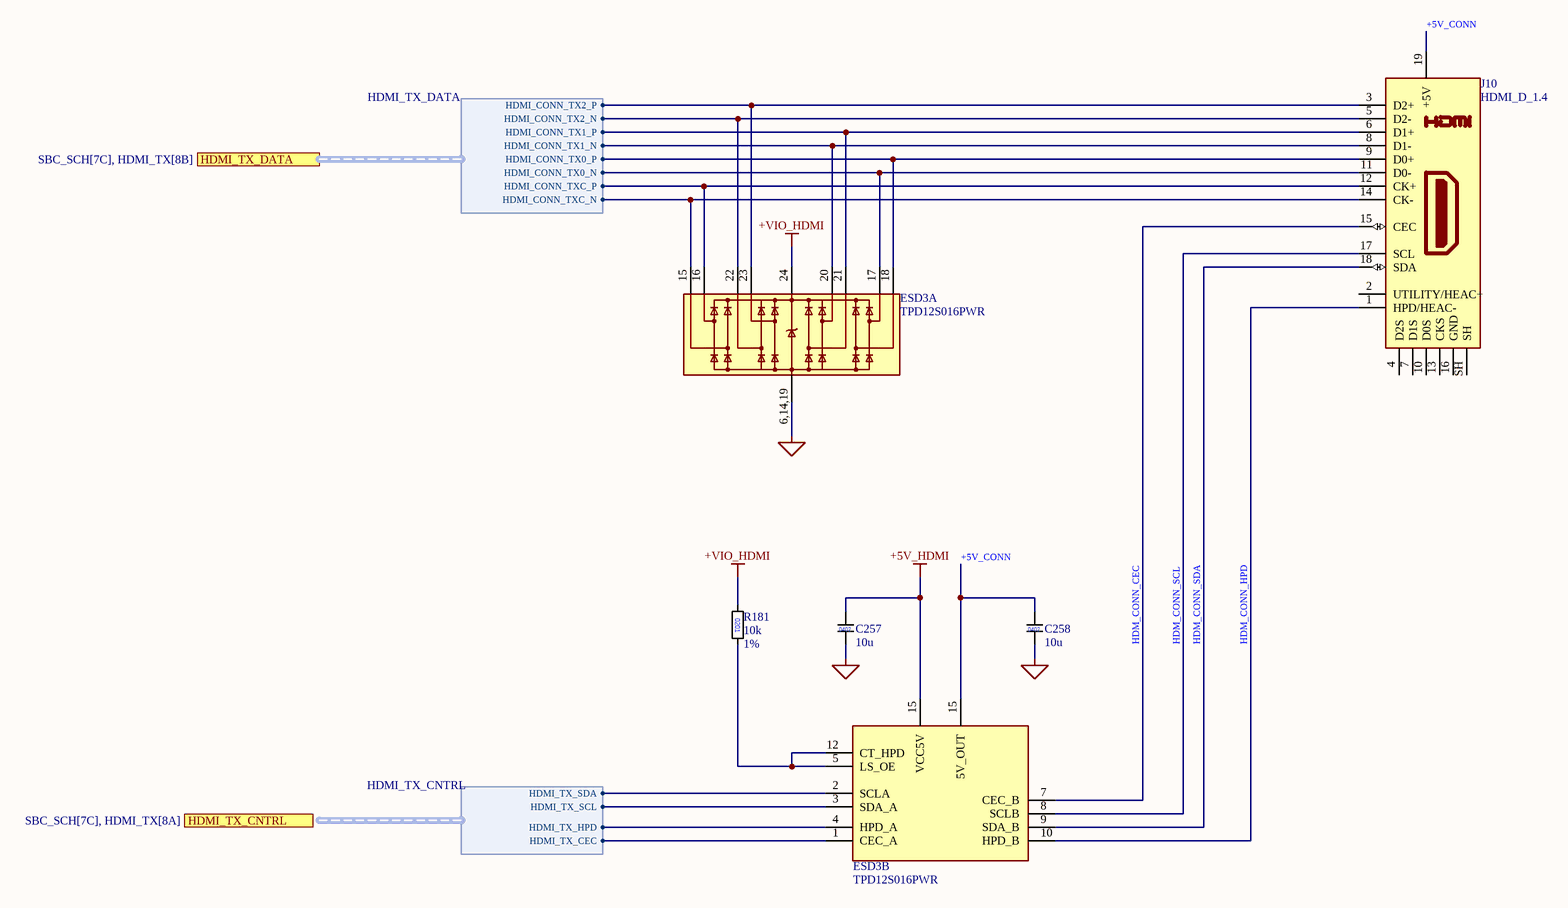
[diagram p17: 18_HDMI_Connector.SchDoc]

### Parts
C257  value 10u  [C0402]  (hidden comment: 4u7)
C258  value 10u  [C0402]  (hidden comment: 4u7)
ESD3  TPD12S016PWR  [TSOP65P640X120-24N]  (parts A,B of 2)
J10  HDMI_D_1.4  [HDMI_Micro-D_Molex_46765-1xxx]
R181  value 10k  Tolerance: 1%  [R0201]  (hidden comment: 0201)

### Ports
HDMI_TX_CNTRL (harness HDMI_TX_CNTRL, see SBC_SCH[7C], HDMI_TX[8A]), HDMI_TX_DATA (harness HDMI_TX_DATA, see SBC_SCH[7C], HDMI_TX[8B])

### Harnesses
HDMI_TX_DATA: HDMI_CONN_TXC_P, HDMI_CONN_TXC_N, HDMI_CONN_TX0_P, HDMI_CONN_TX0_N, HDMI_CONN_TX1_P, HDMI_CONN_TX1_N, HDMI_CONN_TX2_P, HDMI_CONN_TX2_N
HDMI_TX_CNTRL: HDMI_TX_SDA, HDMI_TX_SCL, HDMI_TX_HPD, HDMI_TX_CEC

### Nets
+5V_HDMI: C257.1 ESD3.15(VCC5V)
+VIO_HDMI: ESD3.24(VCCA) R181.1
GND: C257.2 C258.2 ESD3.6,14,19(GND)
+5V_CONN: C258.1 ESD3.15(5V_OUT) J10.19(+5V)
HDM_CONN_CEC: ESD3.7(CEC_B) J10.15(CEC)
HDM_CONN_HPD: ESD3.10(HPD_B) J10.1(HPD/HEAC-)
HDM_CONN_SCL: ESD3.8(SCLB) J10.17(SCL)
HDM_CONN_SDA: ESD3.9(SDA_B) J10.18(SDA)
HDMI_CONN_TX0_N: ESD3.17(D0-) J10.11(D0-) ; port HDMI_TX_DATA.HDMI_CONN_TX0_N
HDMI_CONN_TX0_P: ESD3.18(D0+) J10.9(D0+) ; port HDMI_TX_DATA.HDMI_CONN_TX0_P
HDMI_CONN_TX1_N: ESD3.20(D1-) J10.8(D1-) ; port HDMI_TX_DATA.HDMI_CONN_TX1_N
HDMI_CONN_TX1_P: ESD3.21(D1+) J10.6(D1+) ; port HDMI_TX_DATA.HDMI_CONN_TX1_P
HDMI_CONN_TX2_N: ESD3.22(D2-) J10.5(D2-) ; port HDMI_TX_DATA.HDMI_CONN_TX2_N
HDMI_CONN_TX2_P: ESD3.23(D2+) J10.3(D2+) ; port HDMI_TX_DATA.HDMI_CONN_TX2_P
HDMI_CONN_TXC_N: ESD3.15(CLK-) J10.14(CK-) ; port HDMI_TX_DATA.HDMI_CONN_TXC_N
HDMI_CONN_TXC_P: ESD3.16(CLK+) J10.12(CK+) ; port HDMI_TX_DATA.HDMI_CONN_TXC_P
NetESD3_1: ESD3.1(CEC_A) ; harness HDMI_TX_CNTRL.HDMI_TX_CEC
NetESD3_2: ESD3.2(SCLA) ; harness HDMI_TX_CNTRL.HDMI_TX_SDA
NetESD3_3: ESD3.3(SDA_A) ; harness HDMI_TX_CNTRL.HDMI_TX_SCL
NetESD3_4: ESD3.4(HPD_A) ; harness HDMI_TX_CNTRL.HDMI_TX_HPD
NetESD3_5: ESD3.5(LS_OE) ESD3.12(CT_HPD) R181.2

Not connected (* = marked no-connect by the designer): J10 2(UTILITY/HEAC+) 4(D2S) 7(D1S) 10(D0S) 13(CKS) 16(GND) SH

### Notes on the sheet
- (in symbol C_0402) 0402

### Library data of the parts
C257 C258 = C_0402: MLCC 0402; Manufacturer_Name: *; Manufacturer_Part_Number: *
ESD3 = TPD12S016PWR: HDMI TSSOP-24 Interface 3.4Gbps 4.5V~5.5V I2C; Manufacturer_Name: Texas Instrument; Manufacturer_Part_Number: TPD12S016PWR; Value: TPD12S016PWR
J10 = HDMI_D_1.4: HDMI 1.4+ type D connector; Datasheet: http://pinoutguide.com/PortableDevices/micro_hdmi_type_d_pinout.shtml; ComponentLink1Description: Datasheet; ComponentLink1URL: http://pinoutguide.com/PortableDevices/micro_hdmi_type_d_pinout.shtml
R181 = R_0201: Manufacturer_Name: *; Manufacturer_Part_Number: *

## Sheet 19_CSI.SchDoc
size A3; SheetNumber: 19; SheetTotal: 21
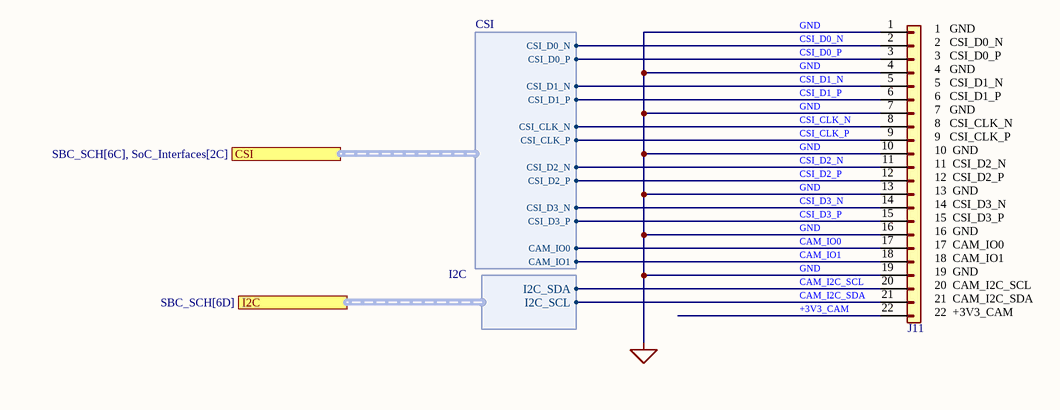
[diagram p18: 19_CSI.SchDoc]

### Parts
J11  Conn_01x22  [5019512230]  (value not drawn)

### Ports
CSI (harness CSI, see SBC_SCH[6C], SoC_Interfaces[2C]), I2C (harness I2C, see SBC_SCH[6D])

### Harnesses
CSI: CSI_D0_N, CSI_D0_P, CSI_D1_N, CSI_D1_P, CSI_CLK_N, CSI_CLK_P, CSI_D2_N, CSI_D2_P, CSI_D3_N, CSI_D3_P, CAM_IO0, CAM_IO1
I2C: I2C_SDA, I2C_SCL

### Nets
GND: J11.1(Pin_1) J11.4(Pin_4) J11.7(Pin_7) J11.10(Pin_10) J11.13(Pin_13) J11.16(Pin_16) J11.19(Pin_19)
+3V3_CAM: J11.22(Pin_22)
CAM_I2C_SCL: J11.20(Pin_20) ; port I2C.I2C_SDA
CAM_I2C_SDA: J11.21(Pin_21) ; port I2C.I2C_SCL
CAM_IO0: J11.17(Pin_17) ; port CSI.CAM_IO0
CAM_IO1: J11.18(Pin_18) ; port CSI.CAM_IO1
CSI_CLK_N: J11.8(Pin_8) ; port CSI.CSI_CLK_N
CSI_CLK_P: J11.9(Pin_9) ; port CSI.CSI_CLK_P
CSI_D0_N: J11.2(Pin_2) ; port CSI.CSI_D0_N
CSI_D0_P: J11.3(Pin_3) ; port CSI.CSI_D0_P
CSI_D1_N: J11.5(Pin_5) ; port CSI.CSI_D1_N
CSI_D1_P: J11.6(Pin_6) ; port CSI.CSI_D1_P
CSI_D2_N: J11.11(Pin_11) ; port CSI.CSI_D2_N
CSI_D2_P: J11.12(Pin_12) ; port CSI.CSI_D2_P
CSI_D3_N: J11.14(Pin_14) ; port CSI.CSI_D3_N
CSI_D3_P: J11.15(Pin_15) ; port CSI.CSI_D3_P

### Notes on the sheet
- (near J11) 1   GND
  2   CSI_D0_N
  3   CSI_D0_P
  4   GND
  5   CSI_D1_N
  6   CSI_D1_P
  7   GND
  8   CSI_CLK_N
  9   CSI_CLK_P
  10  GND
  11  CSI_D2_N
  12  CSI_D2_P
  13  GND
  14  CSI_D3_N
  15  CSI_D3_P
  16  GND
  17  CAM_IO0
  18  CAM_IO1
  19  GND
  20  CAM_I2C_SCL
  21  CAM_I2C_SDA
  22  +3V3_CAM

### Library data of the parts
J11 = Conn_01x22: Generic connector, single row, 01x22, script generated (kicad-library-utils/schlib/autogen/connector/); Value: *; Manufacturer_Name: *; Manufacturer_Part_Number: *

## Sheet 10_USB_Connectors.SchDoc
size A3; SheetNumber: 20; SheetTotal: 21
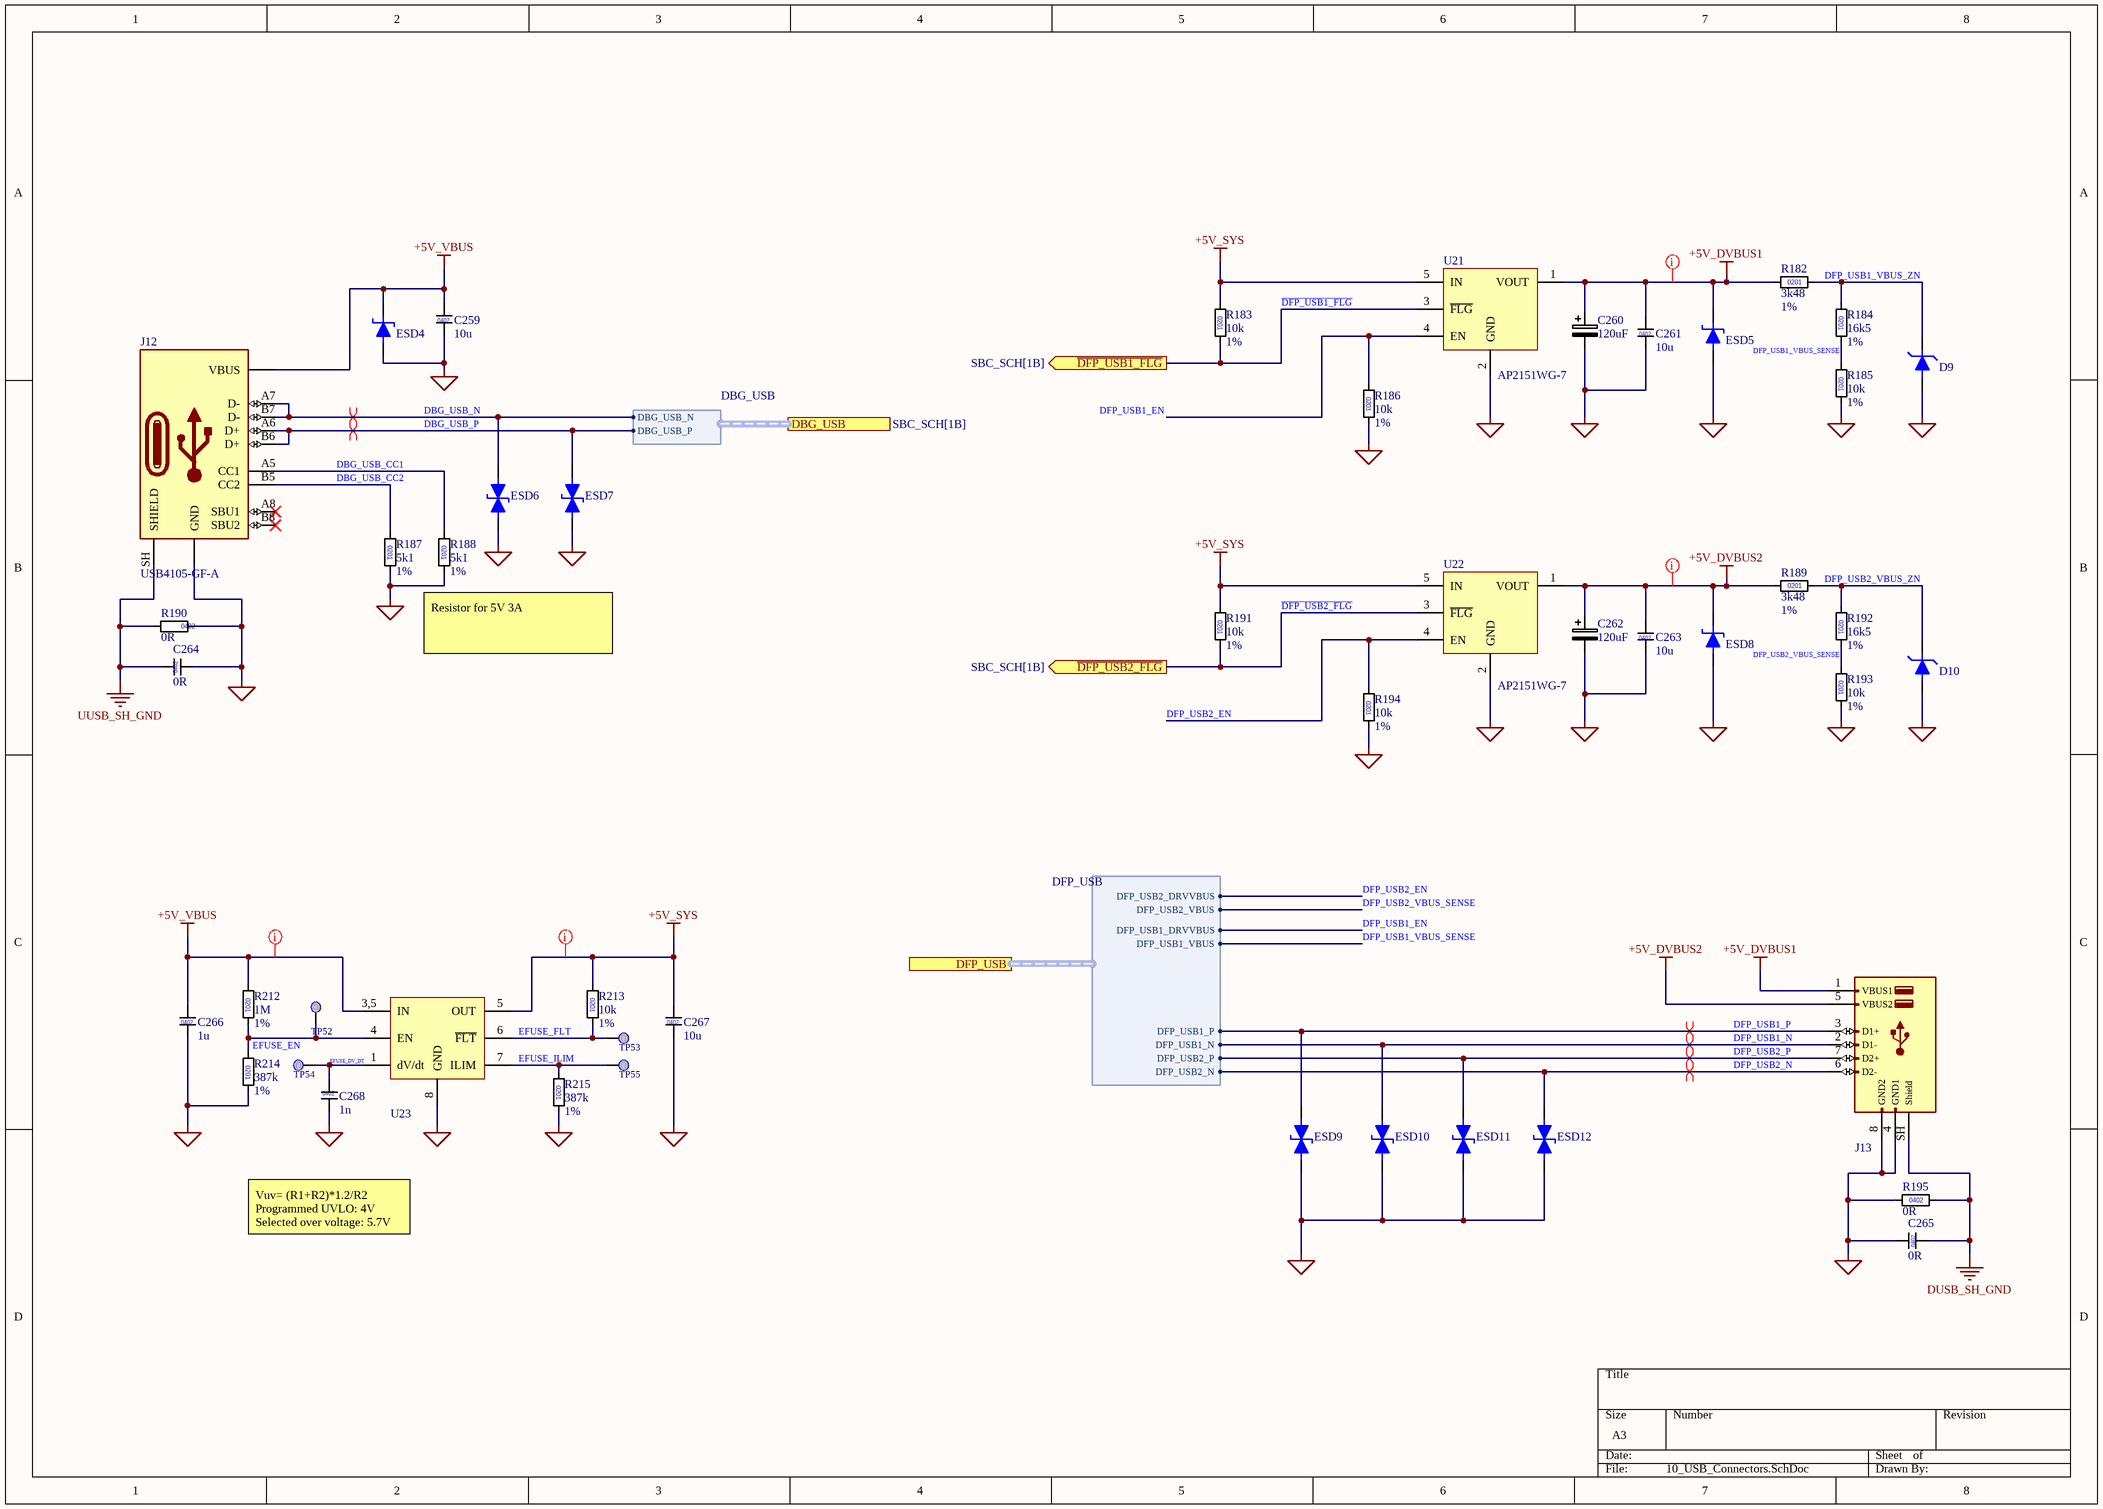
[diagram p19: 10_USB_Connectors.SchDoc]

### Parts
C259  value 10u  [C0402]  (hidden comment: 4u7)
C260  value 120uF  (hidden comment: C_Polarized)
C261  value 10u  [C0402]  (hidden comment: 4u7)
C262  value 120uF  (hidden comment: C_Polarized)
C263  value 10u  [C0402]  (hidden comment: 4u7)
C264  value 0R  [C0402]  (hidden comment: C_0402)
C265  value 0R  [C0402]  (hidden comment: C_0402)
C266  value 1u  [C0402]  (hidden comment: 4u7)
C267  value 10u  [C0402]  (hidden comment: 4u7)
C268  value 1n  [C0402]  (hidden comment: C_0402)
D9  D_Filled  [D_SOD-523]  (value not drawn)
D10  D_Filled  [D_SOD-523]  (value not drawn)
ESD4  ESD  [D_SOD-923]  (value not drawn)
ESD5  ESD  [D_SOD-923]  (value not drawn)
ESD6  D_Filled  [ESD341]  (value not drawn)
ESD7  D_Filled  [ESD341]  (value not drawn)
ESD8  ESD  [D_SOD-923]  (value not drawn)
ESD9  D_Filled  [ESD341]  (value not drawn)
ESD10  D_Filled  [ESD341]  (value not drawn)
ESD11  D_Filled  [ESD341]  (value not drawn)
ESD12  D_Filled  [ESD341]  (value not drawn)
J12  value USB4105-GF-A  [USB_C_Receptacle_GCT_USB4105-xx-A_16P_TopMnt_Horizontal]  (hidden comment: USB_C_Receptacle_USB2.0_16P)
J13  USB_A_Stacked  [USB_A_CUI_UJ2-ADH-TH_Horizontal_Stacked]  (value not drawn)
R182  value 3k48  Tolerance: 1%  [R0201]  (hidden comment: 0201)
R183  value 10k  Tolerance: 1%  [R0201]  (hidden comment: 0201)
R184  value 16k5  Tolerance: 1%  [R0201]  (hidden comment: 0201)
R185  value 10k  Tolerance: 1%  [R0201]  (hidden comment: 0201)
R186  value 10k  Tolerance: 1%  [R0201]  (hidden comment: 0201)
R187  value 5k1  Tolerance: 1%  [R0201]  (hidden comment: 0201)
R188  value 5k1  Tolerance: 1%  [R0201]  (hidden comment: 0201)
R189  value 3k48  Tolerance: 1%  [R0201]  (hidden comment: 0201)
R190  value 0R  [R0402]  (hidden comment: 0402)
R191  value 10k  Tolerance: 1%  [R0201]  (hidden comment: 0201)
R192  value 16k5  Tolerance: 1%  [R0201]  (hidden comment: 0201)
R193  value 10k  Tolerance: 1%  [R0201]  (hidden comment: 0201)
R194  value 10k  Tolerance: 1%  [R0201]  (hidden comment: 0201)
R195  value 0R  [R0402]  (hidden comment: 0402)
R212  value 1M  Tolerance: 1%  [R0201]  (hidden comment: 0201)
R213  value 10k  Tolerance: 1%  [R0201]  (hidden comment: 0201)
R214  value 387k  Tolerance: 1%  [R0201]  (hidden comment: 0201)
R215  value 387k  Tolerance: 1%  [R0201]  (hidden comment: 0201)
TP52  Testpoint 0.5mm  [TP_0.50mm]  (value not drawn)  (no BOM)
TP53  Testpoint 0.5mm  [TP_0.50mm]  (value not drawn)  (no BOM)
TP54  Testpoint 0.5mm  [TP_0.50mm]  (value not drawn)  (no BOM)
TP55  Testpoint 0.5mm  [TP_0.50mm]  (value not drawn)  (no BOM)
U21  AP2151WG-7  [SOT-23-5]
U22  AP2151WG-7  [SOT-23-5]
U23  TPS259531  [TPS259531]  (value not drawn)

### Ports
DBG_USB (harness DBG_USB, see SBC_SCH[1B]), DFP_USB (harness DFP_USB, see SBC_SCH[1B]), ~{DFP_USB1_FLG} (out, see SBC_SCH[1B]), ~{DFP_USB2_FLG} (out, see SBC_SCH[1B])

### Harnesses
DBG_USB: DBG_USB_N, DBG_USB_P
DFP_USB: DFP_USB1_DRVVBUS, DFP_USB1_VBUS, DFP_USB2_DRVVBUS, DFP_USB2_VBUS, DFP_USB1_P, DFP_USB1_N, DFP_USB2_P, DFP_USB2_N

### Nets
+5V_DVBUS1: C260.1 C261.1 ESD5.1(K) J13.1(VBUS1) R182.1 U21.1(VOUT)
+5V_DVBUS2: C262.1 C263.1 ESD8.1(K) J13.5(VBUS2) R189.1 U22.1(VOUT)
+5V_SYS: C267.1 R183.1 R191.1 R213.1 U21.5(IN) U22.5(IN) U23.5(OUT)
+5V_VBUS: C259.1 C266.1 ESD4.1(K) J12.A4,A9,B4,B9(VBUS) R212.1 U23.3,5(IN)
DUSB_SH_GND: C265.2 J13.SH(Shield) R195.R?
GND: C259.2 C260.2 C261.2 C262.2 C263.2 C264.1 C265.1 C266.2 C267.2 C268.1 D9.2(A) D10.2(A) ESD4.2(A) ESD5.2(A) ESD6.1(K) ESD7.1(K) ESD8.2(A) ESD9.1(K) ESD10.1(K) ESD11.1(K) ESD12.1(K) J12.A1,A12,B1,B12(GND) J13.4(GND1) J13.8(GND2) R185.2 R186.2 R187.2 R188.2 R190.1 R193.2 R194.2 R195.1 R214.2 R215.2 U21.2(GND) U22.2(GND) U23.8(GND)
UUSB_SH_GND: C264.2 J12.SH(SHIELD) R190.R?
~{DFP_USB1_FLG}: R183.2 U21.3(~{FLG}) ; port ~{DFP_USB1_FLG}
~{DFP_USB2_FLG}: R191.2 U22.3(~{FLG}) ; port ~{DFP_USB2_FLG}
DBG_USB_CC1: J12.A5(CC1) R188.1
DBG_USB_CC2: J12.B5(CC2) R187.1
DBG_USB_N: ESD6.2(A) J12.A7(D-) J12.B7(D-) ; port DBG_USB.DBG_USB_N
DBG_USB_P: ESD7.2(A) J12.A6(D+) J12.B6(D+) ; port DBG_USB.DBG_USB_P
DFP_USB1_EN: R186.1 U21.4(EN) ; port DFP_USB.DFP_USB1_DRVVBUS
DFP_USB1_N: ESD10.2(A) J13.2(D1-) ; port DFP_USB.DFP_USB1_N
DFP_USB1_P: ESD9.2(A) J13.3(D1+) ; port DFP_USB.DFP_USB1_P
DFP_USB1_VBUS_SENSE: R184.2 R185.1 ; port DFP_USB.DFP_USB1_VBUS
DFP_USB1_VBUS_ZN: D9.1(K) R182.2 R184.1
DFP_USB2_EN: R194.1 U22.4(EN) ; port DFP_USB.DFP_USB2_DRVVBUS
DFP_USB2_N: ESD12.2(A) J13.6(D2-) ; port DFP_USB.DFP_USB2_N
DFP_USB2_P: ESD11.2(A) J13.7(D2+) ; port DFP_USB.DFP_USB2_P
DFP_USB2_VBUS_SENSE: R192.2 R193.1 ; port DFP_USB.DFP_USB2_VBUS
DFP_USB2_VBUS_ZN: D10.1(K) R189.2 R192.1
EFUSE_DV_DT: C268.2 TP54.TP U23.1(dV/dt)
EFUSE_EN: R212.2 R214.1 TP52.TP U23.4(EN)
EFUSE_FLT: R213.2 TP53.TP U23.6(~{FLT})
EFUSE_ILIM: R215.1 TP55.TP U23.7(ILIM)

Not connected (* = marked no-connect by the designer): J12 A8(SBU1)* B8(SBU2)*

### Layout directives
differential pair: DBG_USB_N, DBG_USB_P, DFP_USB1_N, DFP_USB1_P, DFP_USB2_N, DFP_USB2_P
net class PWR: +5V_DVBUS1, +5V_DVBUS2, +5V_SYS, +5V_VBUS

### Notes on the sheet
- Resistor for 5V 3A
- Vuv= (R1+R2)*1.2/R2
  Programmed UVLO: 4V
  Selected over voltage: 5.7V
- (in symbol C_0402) 0402

### Library data of the parts
C259 C261 C263-C268 = C_0402: MLCC 0402; Manufacturer_Name: *; Manufacturer_Part_Number: *
C260 C262 = C_Polarized: Polarized capacitor; Manufacturer_Name: *; Manufacturer_Part_Number: *
D9 D10 = D_Zener: Diode, filled shape; Manufacturer_Name: Panjit International Inc.; Value: BAT54TS_R1_00001; Manufacturer Part Number: BAT54TS_R1_00001
ESD4 ESD5 ESD8 = D_ESDU: ESD diode uni-directional; Manufacturer_Name: TOSHIBA; Value: DF2S8.2FS,L3M; Manufacturer Part Number: DF2S8.2FS,L3M
ESD6 ESD7 ESD9-ESD12 = D_ESDB: ESD diode bi-directional; Manufacturer_Name: TECH PUBLIC; Value: ESD341DPLR; Manufacturer Part Number: ESD341DPLR
J12 = USB_C_Receptacle_USB2.0_16P: USB 2.0-only 16P Type-C Receptacle connector; Manufacturer_Name: GCT; Datasheet: https://www.usb.org/sites/default/files/documents/usb_type-c.zip; ComponentLink1Description: Datasheet; ComponentLink1URL: https://www.usb.org/sites/default/files/documents/usb_type-c.zip; Manufacturer_Part_Number: USB4105-GF-A
J13 = USB_A_Stacked: USB Type A connector, stacked; Manufacturer_Name: SHOU HAN; Value: AF SS-JB17.6; Manufacturer_Part_Number: AF SS-JB17.6
R182-R189 R191-R194 R212-R215 = R_0201: Manufacturer_Name: *; Manufacturer_Part_Number: *
R190 R195 = R_0402: Tolerance: 1%; Manufacturer_Name: *; Manufacturer_Part_Number: *
U21 U22 = AP2151WG-7: Linear Voltage Regulator IC Positive Fixed 1 Output 300mA SOT-25; Manufacturer_Name: Diodes Incorporated; Manufacturer_Part_Number: AP2151WG-7; Value: AP2151WG-7
U23 = TPS259531: E-Fuse 34mΩ Integrated FET Surface Mount WSON-8-EP(2x2); Manufacturer_Name: Texas Instruments; Manufacturer_Part_Number: TPS259531DSGR; Value: TPS259531

## Sheet 04_SoC_CFG_GPIOs.SchDoc
size A3; SheetNumber: 21; SheetTotal: 21
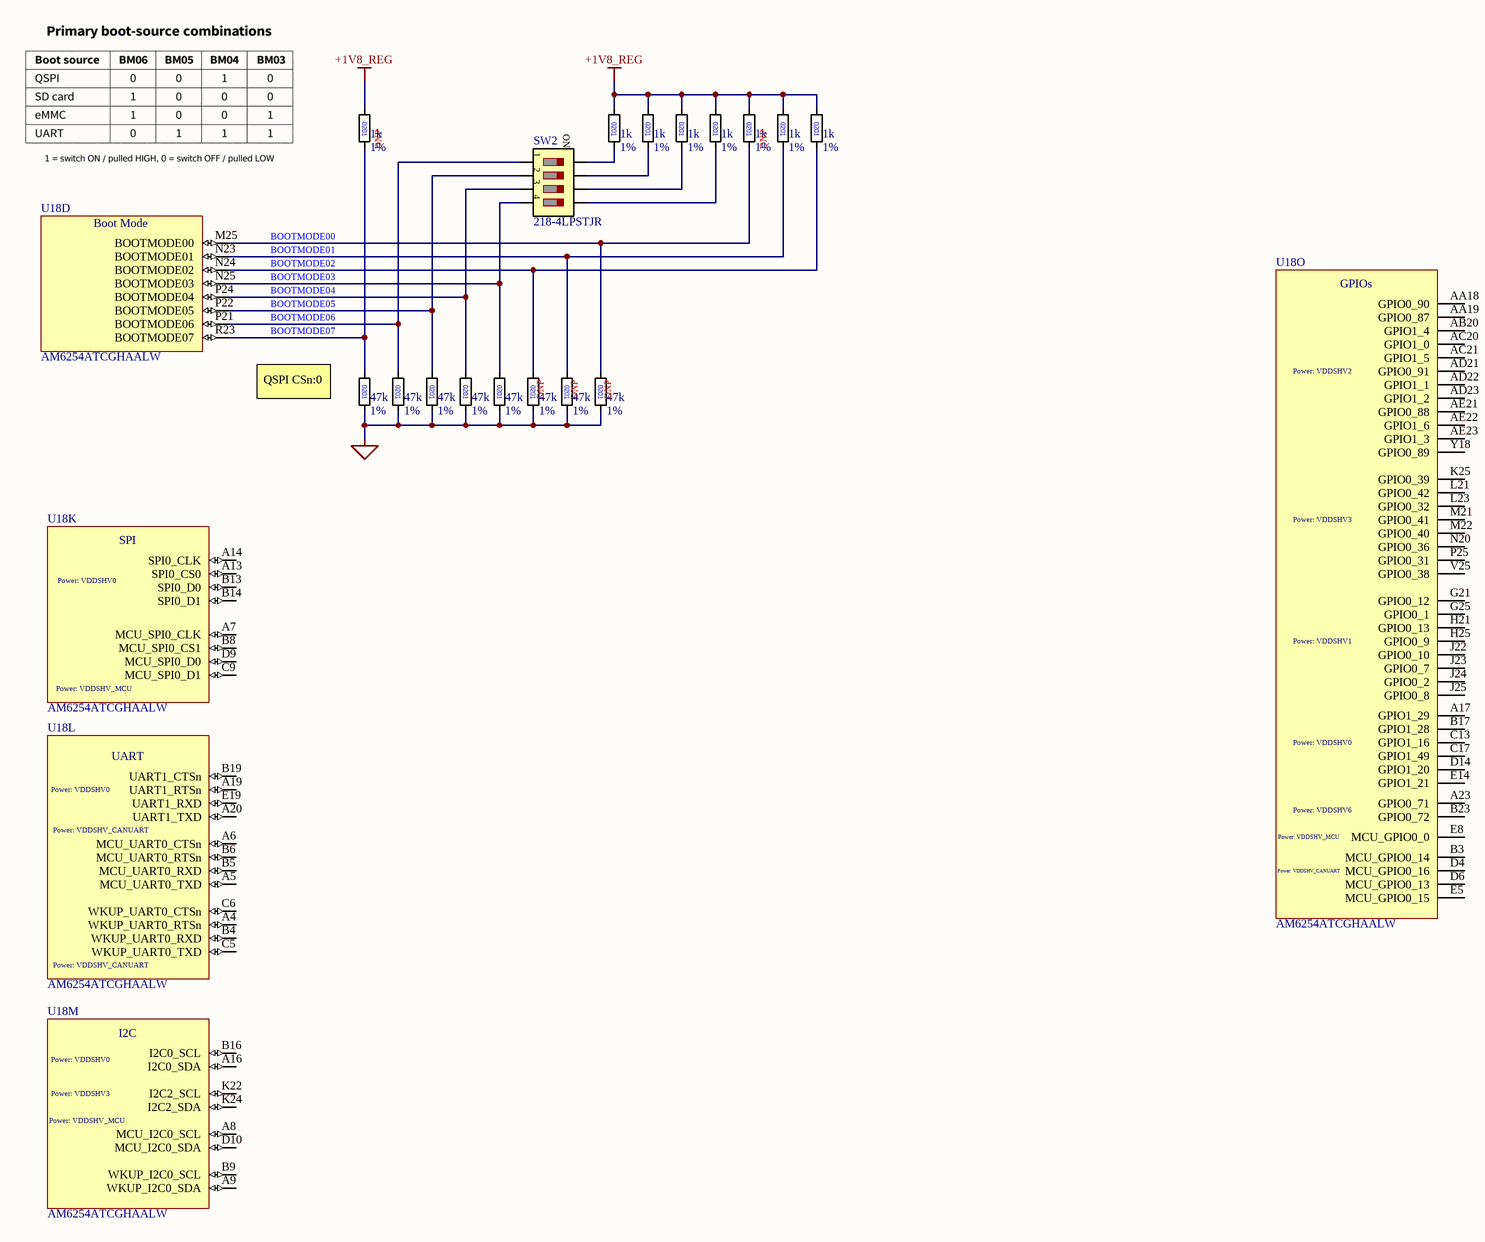
[diagram p20: 04_SoC_CFG_GPIOs.SchDoc]

### Parts
(Parts that share a designator on the sheet are numbered #1, #2 ... from top to bottom, then left to right.)
R196  value 1k  Tolerance: 1%  [R0201]  (hidden comment: 0201)
R197  value 1k  Tolerance: 1%  [R0201]  (hidden comment: 0201)
R198  value 1k  Tolerance: 1%  [R0201]  (hidden comment: 0201)
R199  value 1k  Tolerance: 1%  [R0201]  (hidden comment: 0201)
R200  value 1k  Tolerance: 1%  [R0201]  (hidden comment: 0201)
R201  value 1k  Tolerance: 1%  [R0201]  (hidden comment: 0201)
R202  value 1k  Tolerance: 1%  [R0201]  (hidden comment: 0201)
R203  value 1k  Tolerance: 1%  [R0201]  (hidden comment: 0201)
R204  value 47k  Tolerance: 1%  [R0201]  (hidden comment: 0201)
R205  value 47k  Tolerance: 1%  [R0201]  (hidden comment: 0201)
R206  value 47k  Tolerance: 1%  [R0201]  (hidden comment: 0201)
R207  value 47k  Tolerance: 1%  [R0201]  (hidden comment: 0201)
R208  value 47k  Tolerance: 1%  [R0201]  (hidden comment: 0201)
R209  value 47k  Tolerance: 1%  [R0201]  (hidden comment: 0201)
R210  value 47k  Tolerance: 1%  [R0201]  (hidden comment: 0201)
R211  value 47k  Tolerance: 1%  [R0201]  (hidden comment: 0201)
SW2  218-4LPSTJR  [SW_DIP_SPSTx04_Slide]
U18#1  AM6254ATCGHAALW  [AM6254ATCGHAALW]  (parts D,K,M,O of 15)
U18#2  AM6254ATCGHAALW  [AM6254ATCGHAALW]  (part L of 14)

### Nets
+1V8_REG: R196.1 R197.1 R198.1 R199.1 R200.1 R201.1 R202.1 R203.1
GND: R204.2 R205.2 R206.2 R207.2 R208.2 R209.2 R210.2 R211.2
BOOTMODE00: R201.2 R211.1 U18#1.M25(BOOTMODE00)
BOOTMODE01: R202.2 R210.1 U18#1.N23(BOOTMODE01)
BOOTMODE02: R203.2 R209.1 U18#1.N24(BOOTMODE02)
BOOTMODE03: R208.1 SW2.4 U18#1.N25(BOOTMODE03)
BOOTMODE04: R207.1 SW2.3 U18#1.P24(BOOTMODE04)
BOOTMODE05: R206.1 SW2.2 U18#1.P22(BOOTMODE05)
BOOTMODE06: R205.1 SW2.1 U18#1.P21(BOOTMODE06)
BOOTMODE07: R196.2 R204.1 U18#1.R23(BOOTMODE07)
NetR197_2: R197.2 SW2.8
NetR198_2: R198.2 SW2.7
NetR199_2: R199.2 SW2.6
NetR200_2: R200.2 SW2.5

Not connected (* = marked no-connect by the designer): U18#1 A7(MCU_SPI0_CLK) A8(MCU_I2C0_SCL) A9(WKUP_I2C0_SDA) A13(SPI0_CS0) A14(SPI0_CLK) A16(I2C0_SDA) A17(GPIO1_29) A23(GPIO0_71) AA18(GPIO0_90) AA19(GPIO0_87) AB20(GPIO1_4) AC20(GPIO1_0) AC21(GPIO1_5) AD21(GPIO0_91) AD22(GPIO1_1) AD23(GPIO1_2) AE21(GPIO0_88) AE22(GPIO1_6) AE23(GPIO1_3) B3(MCU_GPIO0_14) B8(MCU_SPI0_CS1) B9(WKUP_I2C0_SCL) B13(SPI0_D0) B14(SPI0_D1) B16(I2C0_SCL) B17(GPIO1_28) B23(GPIO0_72) C9(MCU_SPI0_D1) C13(GPIO1_16) C17(GPIO1_49) D4(MCU_GPIO0_16) D6(MCU_GPIO0_13) D9(MCU_SPI0_D0) D10(MCU_I2C0_SDA) D14(GPIO1_20) E5(MCU_GPIO0_15) E8(MCU_GPIO0_0) E14(GPIO1_21) G21(GPIO0_12) G25(GPIO0_1) H21(GPIO0_13) H25(GPIO0_9) J22(GPIO0_10) J23(GPIO0_7) J24(GPIO0_2) J25(GPIO0_8) K22(I2C2_SCL) K24(I2C2_SDA) K25(GPIO0_39) L21(GPIO0_42) L23(GPIO0_32) M21(GPIO0_41) M22(GPIO0_40) N20(GPIO0_36) P25(GPIO0_31) V25(GPIO0_38) Y18(GPIO0_89); U18#2 A4(WKUP_UART0_RTSn) A5(MCU_UART0_TXD) A6(MCU_UART0_CTSn) A19(UART1_RTSn) A20(UART1_TXD) B4(WKUP_UART0_RXD) B5(MCU_UART0_RXD) B6(MCU_UART0_RTSn) B19(UART1_CTSn) C5(WKUP_UART0_TXD) C6(WKUP_UART0_CTSn) E19(UART1_RXD)

### Notes on the sheet
- (near R196) DNP
- (near R201) DNP
- (near R204) QSPI CSn:0
- (near R209) DNP
- (near R210) DNP
- (near R211) DNP
- (in symbol AM6254ATCGHAALW, part D) Boot Mode
- (in symbol AM6254ATCGHAALW, part K) SPI; Power: VDDSHV0; Power: VDDSHV_MCU
- (in symbol AM6254ATCGHAALW, part L) UART; Power: VDDSHV0; Power: VDDSHV_CANUART
- (in symbol AM6254ATCGHAALW, part M) I2C; Power: VDDSHV0; Power: VDDSHV3; Power: VDDSHV_MCU
- (in symbol AM6254ATCGHAALW, part O) GPIOs; Power: VDDSHV2; Power: VDDSHV3; Power: VDDSHV1; Power: VDDSHV0; Power: VDDSHV6; Power: VDDSHV_MCU; Power: VDDSHV_CANUART
- (in symbol SW_DIP_4) ON

### Library data of the parts
R196-R211 = R_0201: Manufacturer_Name: *; Manufacturer_Part_Number: *
SW2 = SW_DIP_4: Manufacturer_Name: CTS Electrocomponents; Manufacturer_Part_Number: 218-4LPSTJR
U18#1 U18#2 = AM6254ATCGHAALW: TI AM6254, quad Cortex-A53 SoC, ALW 425-ball FCCSP 13x13mm 0.5mm pitch; separate interface and power units; Pinmux_Note: Each physical ball occurs once under its primary interface. See companion pinmux CSV for alternate functions. Multiplexable digital pads use bidirectional ERC type.; KiCad_Footprint: SamacSys_Parts:BGA425C50P25X25_1300X1300X89; MPN: AM6254ATCGHAALW; Footprint_Note: Unassigned: requires verified ALW0425 425-ball FCCSP, 13x13mm, 0.5mm pitch; do not substitute a fully populated BGA.; Datasheet: https://www.ti.com/lit/ds/symlink/am625.pdf; ComponentLink1Description: Datasheet; ComponentLink1URL: https://www.ti.com/lit/ds/symlink/am625.pdf

## Nets that join several sheets
+1V2_PMIC: 14_DC_Reg_PMIC (R73.2), 03_SoC_Power (11 pins)
+1V8_LDO: 14_DC_Reg_PMIC (R76.2), 03_SoC_Power (13 pins)
+1V8_REG: 14_DC_Reg_PMIC (5 pins), 03_SoC_Power (26 pins), 05_SoC_Interfaces (8 pins), 04_SoC_CFG_GPIOs (8 pins)
+2V5_DRAM: 14_DC_Reg_PMIC (R77.2), 06_DRAM (5 pins)
+3V3_FTDI: 09_FTDI_USB (20 pins), 14_DC_Reg_PMIC (C59.1 R61.2), 08_Voltage_Translator (17 pins)
+3V3_PMIC: 14_DC_Reg_PMIC (11 pins), 03_SoC_Power (10 pins)
+5V_SYS: 14_DC_Reg_PMIC (17 pins), 10_USB_Connectors (7 pins)
+5V_VBUS: 03_SoC_Power (U18#1.H10), 10_USB_Connectors (6 pins)
+VDD_uSD: 14_DC_Reg_PMIC (R74.2), 20_MicroSD_Connector (13 pins), 03_SoC_Power (C222.1 C223.1 U18#1.J18)
GND: 11_Audio_CODEC (18 pins), 09_FTDI_USB (30 pins), 15_ETH_PHY (34 pins), 16_ETH_Magjack (C55.2 C56.1 R60.1), 14_DC_Reg_PMIC (33 pins), 21_WIFI_BLE_Module (33 pins), 06_DRAM (49 pins), 13_eMMC_Flash (29 pins), 08_Voltage_Translator (23 pins), 20_MicroSD_Connector (9 pins), 03_SoC_Power (156 pins), 07_Clock (6 pins), 02_SoC_DRAM_DDR4 (R145.2), 05_SoC_Interfaces (11 pins), 17_HDMI_TX (24 pins), 18_HDMI_Connector (C257.2 C258.2 ESD3.6,14,19), 19_CSI (7 pins), 10_USB_Connectors (37 pins), 04_SoC_CFG_GPIOs (8 pins)
VDD_CORE: 14_DC_Reg_PMIC (R71.2), 03_SoC_Power (39 pins)
VDDR_CORE: 14_DC_Reg_PMIC (R75.2), 03_SoC_Power (17 pins)
~{DDR4_ACT}: 06_DRAM (U10.L3), 02_SoC_DRAM_DDR4 (U18#1.N6)
~{DDR4_ALERT}: 06_DRAM (R99.2 U10.P9), 02_SoC_DRAM_DDR4 (U18#1.R3)
~{DDR4_CAS}: 06_DRAM (U10.M8), 02_SoC_DRAM_DDR4 (U18#1.M4)
~{DDR4_CS}: 06_DRAM (U10.L7), 02_SoC_DRAM_DDR4 (U18#1.L6)
~{DDR4_LDM}: 06_DRAM (U10.E7), 02_SoC_DRAM_DDR4 (U18#1.W5)
~{DDR4_RAS}: 06_DRAM (U10.L8), 02_SoC_DRAM_DDR4 (U18#1.M5)
~{DDR4_RESET}: 06_DRAM (R100.2 R103.1 U10.P1), 02_SoC_DRAM_DDR4 (U18#1.G1)
~{DDR4_UDM}: 06_DRAM (U10.E2), 02_SoC_DRAM_DDR4 (U18#1.H5)
~{DDR4_WE}: 06_DRAM (U10.L2), 02_SoC_DRAM_DDR4 (U18#1.N3)
BT_PCM_CLK: 21_WIFI_BLE_Module (R89.1), 05_SoC_Interfaces (U18#1.B20)
BT_PCM_IN: 21_WIFI_BLE_Module (U9.6), 05_SoC_Interfaces (U18#1.E18)
BT_PCM_OUT: 21_WIFI_BLE_Module (U9.9), 05_SoC_Interfaces (U18#1.B18)
BT_PCM_SYNC: 21_WIFI_BLE_Module (U9.8), 05_SoC_Interfaces (U18#1.D20)
CSI_CLK_N: 05_SoC_Interfaces (U18#1.AD15), 19_CSI (J11.8)
CSI_CLK_P: 05_SoC_Interfaces (U18#1.AE15), 19_CSI (J11.9)
CSI_D0_N: 05_SoC_Interfaces (U18#1.AB14), 19_CSI (J11.2)
CSI_D0_P: 05_SoC_Interfaces (U18#1.AC15), 19_CSI (J11.3)
CSI_D1_N: 05_SoC_Interfaces (U18#1.AD14), 19_CSI (J11.5)
CSI_D1_P: 05_SoC_Interfaces (U18#1.AE14), 19_CSI (J11.6)
CSI_D2_N: 05_SoC_Interfaces (U18#1.AD13), 19_CSI (J11.11)
CSI_D2_P: 05_SoC_Interfaces (U18#1.AE13), 19_CSI (J11.12)
CSI_D3_N: 05_SoC_Interfaces (U18#1.AB12), 19_CSI (J11.14)
CSI_D3_P: 05_SoC_Interfaces (U18#1.AC13), 19_CSI (J11.15)
DBG_USB_N: 09_FTDI_USB (U2.7), 10_USB_Connectors (ESD6.2 J12.A7 J12.B7)
DBG_USB_P: 09_FTDI_USB (U2.8), 10_USB_Connectors (ESD7.2 J12.A6 J12.B6)
DBGT_JTAG_TCK: 09_FTDI_USB (U2.16), 08_Voltage_Translator (U13.1)
DBGT_JTAG_TDI: 09_FTDI_USB (U2.17), 08_Voltage_Translator (U13.2)
DBGT_JTAG_TDO: 09_FTDI_USB (U2.18), 08_Voltage_Translator (U13.3)
DBGT_JTAG_TMS: 09_FTDI_USB (U2.19), 08_Voltage_Translator (U13.4)
DBGT_UART1_CTS: 09_FTDI_USB (U2.29), 08_Voltage_Translator (U14.4)
DBGT_UART1_RTS: 09_FTDI_USB (U2.28), 08_Voltage_Translator (U14.3)
DBGT_UART1_RXD: 09_FTDI_USB (U2.27), 08_Voltage_Translator (U14.2)
DBGT_UART1_TXD: 09_FTDI_USB (U2.26), 08_Voltage_Translator (U14.1)
DBGT_UART2_CTS: 09_FTDI_USB (U2.41), 08_Voltage_Translator (U15.4)
DBGT_UART2_RTS: 09_FTDI_USB (U2.40), 08_Voltage_Translator (U15.3)
DBGT_UART2_RXD: 09_FTDI_USB (U2.39), 08_Voltage_Translator (U15.2)
DBGT_UART2_TXD: 09_FTDI_USB (U2.38), 08_Voltage_Translator (U15.1)
DBGT_UART3_CTS: 09_FTDI_USB (U2.54), 08_Voltage_Translator (U16.4)
DBGT_UART3_RTS: 09_FTDI_USB (U2.53), 08_Voltage_Translator (U16.3)
DBGT_UART3_RXD: 09_FTDI_USB (U2.52), 08_Voltage_Translator (U16.2)
DBGT_UART3_TXD: 09_FTDI_USB (U2.48), 08_Voltage_Translator (U16.1)
DDR4_A0: 06_DRAM (U10.P3), 02_SoC_DRAM_DDR4 (U18#1.J1)
DDR4_A1: 06_DRAM (U10.P7), 02_SoC_DRAM_DDR4 (U18#1.J2)
DDR4_A2: 06_DRAM (U10.R3), 02_SoC_DRAM_DDR4 (U18#1.K3)
DDR4_A3: 06_DRAM (U10.N7), 02_SoC_DRAM_DDR4 (U18#1.L5)
DDR4_A4: 06_DRAM (U10.N3), 02_SoC_DRAM_DDR4 (U18#1.K4)
DDR4_A5: 06_DRAM (U10.P8), 02_SoC_DRAM_DDR4 (U18#1.K1)
DDR4_A6: 06_DRAM (U10.P2), 02_SoC_DRAM_DDR4 (U18#1.R2)
DDR4_A7: 06_DRAM (U10.R8), 02_SoC_DRAM_DDR4 (U18#1.P2)
DDR4_A8: 06_DRAM (U10.R2), 02_SoC_DRAM_DDR4 (U18#1.P1)
DDR4_A9: 06_DRAM (U10.R7), 02_SoC_DRAM_DDR4 (U18#1.P4)
DDR4_A10: 06_DRAM (U10.M3), 02_SoC_DRAM_DDR4 (U18#1.R5)
DDR4_A11: 06_DRAM (U10.T2), 02_SoC_DRAM_DDR4 (U18#1.P5)
DDR4_A12: 06_DRAM (U10.M7), 02_SoC_DRAM_DDR4 (U18#1.R6)
DDR4_A13: 06_DRAM (U10.T8), 02_SoC_DRAM_DDR4 (U18#1.R1)
DDR4_BA0: 06_DRAM (U10.N2), 02_SoC_DRAM_DDR4 (U18#1.M1)
DDR4_BA1: 06_DRAM (U10.N8), 02_SoC_DRAM_DDR4 (U18#1.N1)
DDR4_BG0: 06_DRAM (U10.M2), 02_SoC_DRAM_DDR4 (U18#1.T4)
DDR4_CKE: 06_DRAM (R102.1 U10.K2), 02_SoC_DRAM_DDR4 (U18#1.H2)
DDR4_CLK_N: 06_DRAM (R97.2 U10.K8), 02_SoC_DRAM_DDR4 (U18#1.L2)
DDR4_CLK_P: 06_DRAM (R98.2 U10.K7), 02_SoC_DRAM_DDR4 (U18#1.L1)
DDR4_DQ0: 06_DRAM (U10.G2), 02_SoC_DRAM_DDR4 (U18#1.U1)
DDR4_DQ1: 06_DRAM (U10.F7), 02_SoC_DRAM_DDR4 (U18#1.U3)
DDR4_DQ2: 06_DRAM (U10.H3), 02_SoC_DRAM_DDR4 (U18#1.U2)
DDR4_DQ3: 06_DRAM (U10.H7), 02_SoC_DRAM_DDR4 (U18#1.V5)
DDR4_DQ4: 06_DRAM (U10.H2), 02_SoC_DRAM_DDR4 (U18#1.W2)
DDR4_DQ5: 06_DRAM (U10.H8), 02_SoC_DRAM_DDR4 (U18#1.V6)
DDR4_DQ6: 06_DRAM (U10.J3), 02_SoC_DRAM_DDR4 (U18#1.Y1)
DDR4_DQ7: 06_DRAM (U10.J7), 02_SoC_DRAM_DDR4 (U18#1.W1)
DDR4_DQ8: 06_DRAM (U10.A3), 02_SoC_DRAM_DDR4 (U18#1.F4)
DDR4_DQ9: 06_DRAM (U10.B8), 02_SoC_DRAM_DDR4 (U18#1.G5)
DDR4_DQ10: 06_DRAM (U10.C3), 02_SoC_DRAM_DDR4 (U18#1.F3)
DDR4_DQ11: 06_DRAM (U10.C7), 02_SoC_DRAM_DDR4 (U18#1.H6)
DDR4_DQ12: 06_DRAM (U10.C2), 02_SoC_DRAM_DDR4 (U18#1.E3)
DDR4_DQ13: 06_DRAM (U10.C8), 02_SoC_DRAM_DDR4 (U18#1.G2)
DDR4_DQ14: 06_DRAM (U10.D3), 02_SoC_DRAM_DDR4 (U18#1.F2)
DDR4_DQ15: 06_DRAM (U10.D7), 02_SoC_DRAM_DDR4 (U18#1.F1)
DDR4_LDQS_N: 06_DRAM (U10.F3), 02_SoC_DRAM_DDR4 (U18#1.V2)
DDR4_LDQS_P: 06_DRAM (U10.G3), 02_SoC_DRAM_DDR4 (U18#1.V1)
DDR4_ODT: 06_DRAM (U10.K3), 02_SoC_DRAM_DDR4 (U18#1.H1)
DDR4_PAR: 06_DRAM (U10.T3), 02_SoC_DRAM_DDR4 (U18#1.T1)
DDR4_UDQS_N: 06_DRAM (U10.A7), 02_SoC_DRAM_DDR4 (U18#1.E2)
DDR4_UDQS_P: 06_DRAM (U10.B7), 02_SoC_DRAM_DDR4 (U18#1.E1)
DFP_USB1_EN: 05_SoC_Interfaces (U18#1.C20), 10_USB_Connectors (R186.1 U21.4)
DFP_USB1_N: 05_SoC_Interfaces (U18#1.AD11), 10_USB_Connectors (ESD10.2 J13.2)
DFP_USB1_P: 05_SoC_Interfaces (U18#1.AE11), 10_USB_Connectors (ESD9.2 J13.3)
DFP_USB1_VBUS_SENSE: 05_SoC_Interfaces (U18#1.AC11), 10_USB_Connectors (R184.2 R185.1)
DFP_USB2_EN: 05_SoC_Interfaces (U18#1.F18), 10_USB_Connectors (R194.1 U22.4)
DFP_USB2_N: 05_SoC_Interfaces (U18#1.AE9), 10_USB_Connectors (ESD12.2 J13.6)
DFP_USB2_P: 05_SoC_Interfaces (U18#1.AD10), 10_USB_Connectors (ESD11.2 J13.7)
DFP_USB2_VBUS_SENSE: 05_SoC_Interfaces (U18#1.AB10), 10_USB_Connectors (R192.2 R193.1)
EMMC_CLK: 13_eMMC_Flash (R118.1), 05_SoC_Interfaces (U18#2.Y3)
EMMC_CMD: 13_eMMC_Flash (R108.2 U11.M5), 05_SoC_Interfaces (U18#2.AB1)
EMMC_DATA0: 13_eMMC_Flash (R116.2 U11.A3), 05_SoC_Interfaces (U18#2.AA2)
EMMC_DATA1: 13_eMMC_Flash (R115.2 U11.A4), 05_SoC_Interfaces (U18#2.AA1)
EMMC_DATA2: 13_eMMC_Flash (R114.2 U11.A5), 05_SoC_Interfaces (U18#2.AA3)
EMMC_DATA3: 13_eMMC_Flash (R113.2 U11.B2), 05_SoC_Interfaces (U18#2.Y4)
EMMC_DATA4: 13_eMMC_Flash (R112.2 U11.B3), 05_SoC_Interfaces (U18#2.AB2)
EMMC_DATA5: 13_eMMC_Flash (R111.2 U11.B4), 05_SoC_Interfaces (U18#2.AC1)
EMMC_DATA6: 13_eMMC_Flash (R110.2 U11.B5), 05_SoC_Interfaces (U18#2.AD2)
EMMC_DATA7: 13_eMMC_Flash (R109.2 U11.B6), 05_SoC_Interfaces (U18#2.AC2)
ETH_MDI_TR0_N: 15_ETH_PHY (U4.3), 16_ETH_Magjack (J6.3)
ETH_MDI_TR0_P: 15_ETH_PHY (U4.2), 16_ETH_Magjack (J6.2)
ETH_MDI_TR1_N: 15_ETH_PHY (U4.6), 16_ETH_Magjack (J6.7)
ETH_MDI_TR1_P: 15_ETH_PHY (U4.5), 16_ETH_Magjack (J6.4)
ETH_MDI_TR2_N: 15_ETH_PHY (U4.8), 16_ETH_Magjack (J6.6)
ETH_MDI_TR2_P: 15_ETH_PHY (U4.7), 16_ETH_Magjack (J6.5)
ETH_MDI_TR3_N: 15_ETH_PHY (U4.11), 16_ETH_Magjack (J6.9)
ETH_MDI_TR3_P: 15_ETH_PHY (U4.10), 16_ETH_Magjack (J6.8)
FLASH_QSPI_CS: 13_eMMC_Flash (R125.2 U12.C2), 05_SoC_Interfaces (U18#1.F23)
FLASH_QSPI_IO0: 13_eMMC_Flash (R124.2 U12.D3), 05_SoC_Interfaces (U18#1.E25)
FLASH_QSPI_IO1: 13_eMMC_Flash (R123.2 U12.D2), 05_SoC_Interfaces (U18#1.G24)
FLASH_QSPI_IO2: 13_eMMC_Flash (R122.2 U12.C4), 05_SoC_Interfaces (U18#1.F25)
FLASH_QSPI_IO3: 13_eMMC_Flash (R121.2 U12.D4), 05_SoC_Interfaces (U18#1.F24)
FLASH_QSPI_SCK: 13_eMMC_Flash (R127.1), 05_SoC_Interfaces (U18#1.H24)
FLASH_RESET: 13_eMMC_Flash (R126.2 U12.A4), 05_SoC_Interfaces (U18#1.E24)
HDMI_CONN_TX0_N: 17_HDMI_TX (U20.61), 18_HDMI_Connector (ESD3.17 J10.11)
HDMI_CONN_TX0_P: 17_HDMI_TX (U20.62), 18_HDMI_Connector (ESD3.18 J10.9)
HDMI_CONN_TX1_N: 17_HDMI_TX (U20.64), 18_HDMI_Connector (ESD3.20 J10.8)
HDMI_CONN_TX1_P: 17_HDMI_TX (U20.65), 18_HDMI_Connector (ESD3.21 J10.6)
HDMI_CONN_TX2_N: 17_HDMI_TX (U20.67), 18_HDMI_Connector (ESD3.22 J10.5)
HDMI_CONN_TX2_P: 17_HDMI_TX (U20.68), 18_HDMI_Connector (ESD3.23 J10.3)
HDMI_CONN_TXC_N: 17_HDMI_TX (U20.58), 18_HDMI_Connector (ESD3.15 J10.14)
HDMI_CONN_TXC_P: 17_HDMI_TX (U20.59), 18_HDMI_Connector (ESD3.16 J10.12)
HDMI_D0: 05_SoC_Interfaces (U18#1.U22), 17_HDMI_TX (U20.32)
HDMI_D1: 05_SoC_Interfaces (U18#1.V24), 17_HDMI_TX (U20.31)
HDMI_D2: 05_SoC_Interfaces (U18#1.W25), 17_HDMI_TX (U20.30)
HDMI_D3: 05_SoC_Interfaces (U18#1.W24), 17_HDMI_TX (U20.29)
HDMI_D4: 05_SoC_Interfaces (U18#1.Y25), 17_HDMI_TX (U20.28)
HDMI_D5: 05_SoC_Interfaces (U18#1.Y24), 17_HDMI_TX (U20.27)
HDMI_D6: 05_SoC_Interfaces (U18#1.Y23), 17_HDMI_TX (U20.25)
HDMI_D7: 05_SoC_Interfaces (U18#1.AA25), 17_HDMI_TX (U20.24)
HDMI_D8: 05_SoC_Interfaces (U18#1.V21), 17_HDMI_TX (U20.23)
HDMI_D9: 05_SoC_Interfaces (U18#1.W21), 17_HDMI_TX (U20.20)
HDMI_D10: 05_SoC_Interfaces (U18#1.V20), 17_HDMI_TX (U20.19)
HDMI_D11: 05_SoC_Interfaces (U18#1.AA23), 17_HDMI_TX (U20.18)
HDMI_D12: 05_SoC_Interfaces (U18#1.AB25), 17_HDMI_TX (U20.17)
HDMI_D13: 05_SoC_Interfaces (U18#1.AA24), 17_HDMI_TX (U20.16)
HDMI_D14: 05_SoC_Interfaces (U18#1.Y22), 17_HDMI_TX (U20.15)
HDMI_D15: 05_SoC_Interfaces (U18#1.AA21), 17_HDMI_TX (U20.14)
HDMI_D16: 05_SoC_Interfaces (R154.2 R164.1 U18#1.R24), 17_HDMI_TX (R169.1)
HDMI_D17: 05_SoC_Interfaces (R153.2 R163.1 U18#1.R25), 17_HDMI_TX (R170.1)
HDMI_D18: 05_SoC_Interfaces (R152.2 R162.1 U18#1.T25), 17_HDMI_TX (R171.1)
HDMI_D19: 05_SoC_Interfaces (R151.2 R161.1 U18#1.R21), 17_HDMI_TX (R172.1)
HDMI_D20: 05_SoC_Interfaces (R150.2 R160.1 U18#1.T22), 17_HDMI_TX (R173.1)
HDMI_D21: 05_SoC_Interfaces (R149.2 R159.1 U18#1.T24), 17_HDMI_TX (R174.1)
HDMI_D22: 05_SoC_Interfaces (R148.2 R158.1 U18#1.U25), 17_HDMI_TX (R175.1)
HDMI_D23: 05_SoC_Interfaces (R147.2 R157.1 U18#1.U24), 17_HDMI_TX (R176.1)
HDMI_DE: 05_SoC_Interfaces (U18#1.Y20), 17_HDMI_TX (U20.33)
HDMI_HSYNC: 05_SoC_Interfaces (U18#1.AB24), 17_HDMI_TX (U20.34)
HDMI_I2S_DIN: 05_SoC_Interfaces (U18#1.L25), 17_HDMI_TX (U20.41)
HDMI_I2S_SCK: 05_SoC_Interfaces (U18#1.M24), 17_HDMI_TX (U20.45)
HDMI_I2S_WS: 05_SoC_Interfaces (U18#1.U23), 17_HDMI_TX (U20.44)
HDMI_IDCK: 05_SoC_Interfaces (U18#1.AC24), 17_HDMI_TX (R168.1)
HDMI_VSYNC: 05_SoC_Interfaces (U18#1.AC25), 17_HDMI_TX (U20.35)
I2S_ADCOUT: 11_Audio_CODEC (R3.1), 05_SoC_Interfaces (U18#1.E15)
I2S_BCLK: 11_Audio_CODEC (R1.1), 05_SoC_Interfaces (U18#1.B15)
I2S_DACIN: 11_Audio_CODEC (R4.1), 05_SoC_Interfaces (U18#1.C15)
I2S_FS: 11_Audio_CODEC (R2.1), 05_SoC_Interfaces (U18#1.A15)
SD_CD: 20_MicroSD_Connector (ESD2.4 J8.9 R129.2 TP45.TP), 05_SoC_Interfaces (U18#2.D17)
SD_CLK: 20_MicroSD_Connector (R135.1), 05_SoC_Interfaces (U18#2.B22)
SD_CMD: 20_MicroSD_Connector (ESD2.1 J8.3 R130.2), 05_SoC_Interfaces (U18#2.A21)
SD_DATA0: 20_MicroSD_Connector (ESD1.1 J8.7 R134.2), 05_SoC_Interfaces (U18#2.A22)
SD_DATA1: 20_MicroSD_Connector (ESD1.6 J8.8 R133.2), 05_SoC_Interfaces (U18#2.B21)
SD_DATA2: 20_MicroSD_Connector (ESD1.4 J8.1 R132.2), 05_SoC_Interfaces (U18#2.C21)
SD_DATA3: 20_MicroSD_Connector (ESD1.3 J8.2 R131.2), 05_SoC_Interfaces (U18#2.D22)
WIFI_SDIO_CLK: 21_WIFI_BLE_Module (R88.1), 05_SoC_Interfaces (U18#2.D25)
WIFI_SDIO_CMD: 21_WIFI_BLE_Module (R87.2 U9.28), 05_SoC_Interfaces (U18#2.C24)
WIFI_SDIO_DATA_0: 21_WIFI_BLE_Module (R86.2 U9.30), 05_SoC_Interfaces (U18#2.B24)
WIFI_SDIO_DATA_1: 21_WIFI_BLE_Module (R85.2 U9.29), 05_SoC_Interfaces (U18#2.C25)
WIFI_SDIO_DATA_2: 21_WIFI_BLE_Module (R84.2 U9.32), 05_SoC_Interfaces (U18#2.E23)
WIFI_SDIO_DATA_3: 21_WIFI_BLE_Module (R83.2 U9.31), 05_SoC_Interfaces (U18#2.D24)